# EasyEDA Pro project V2_compatibility_export_as_received.epro, schematic SCH_ESP32P4_Prototype_V2.3b6

## Sheets
1 USB_UART/Other IO: Board Name: cm4; Create Date: 2026-07-14; Page Name: 继电器板子; Project Name: New Project_2025-01-23_00-40-50; Schematic Name: Schematic3_7; Update Date: 2026-07-14; Company: 嘉立创EDA; Page Size: A4; Version: V1.0
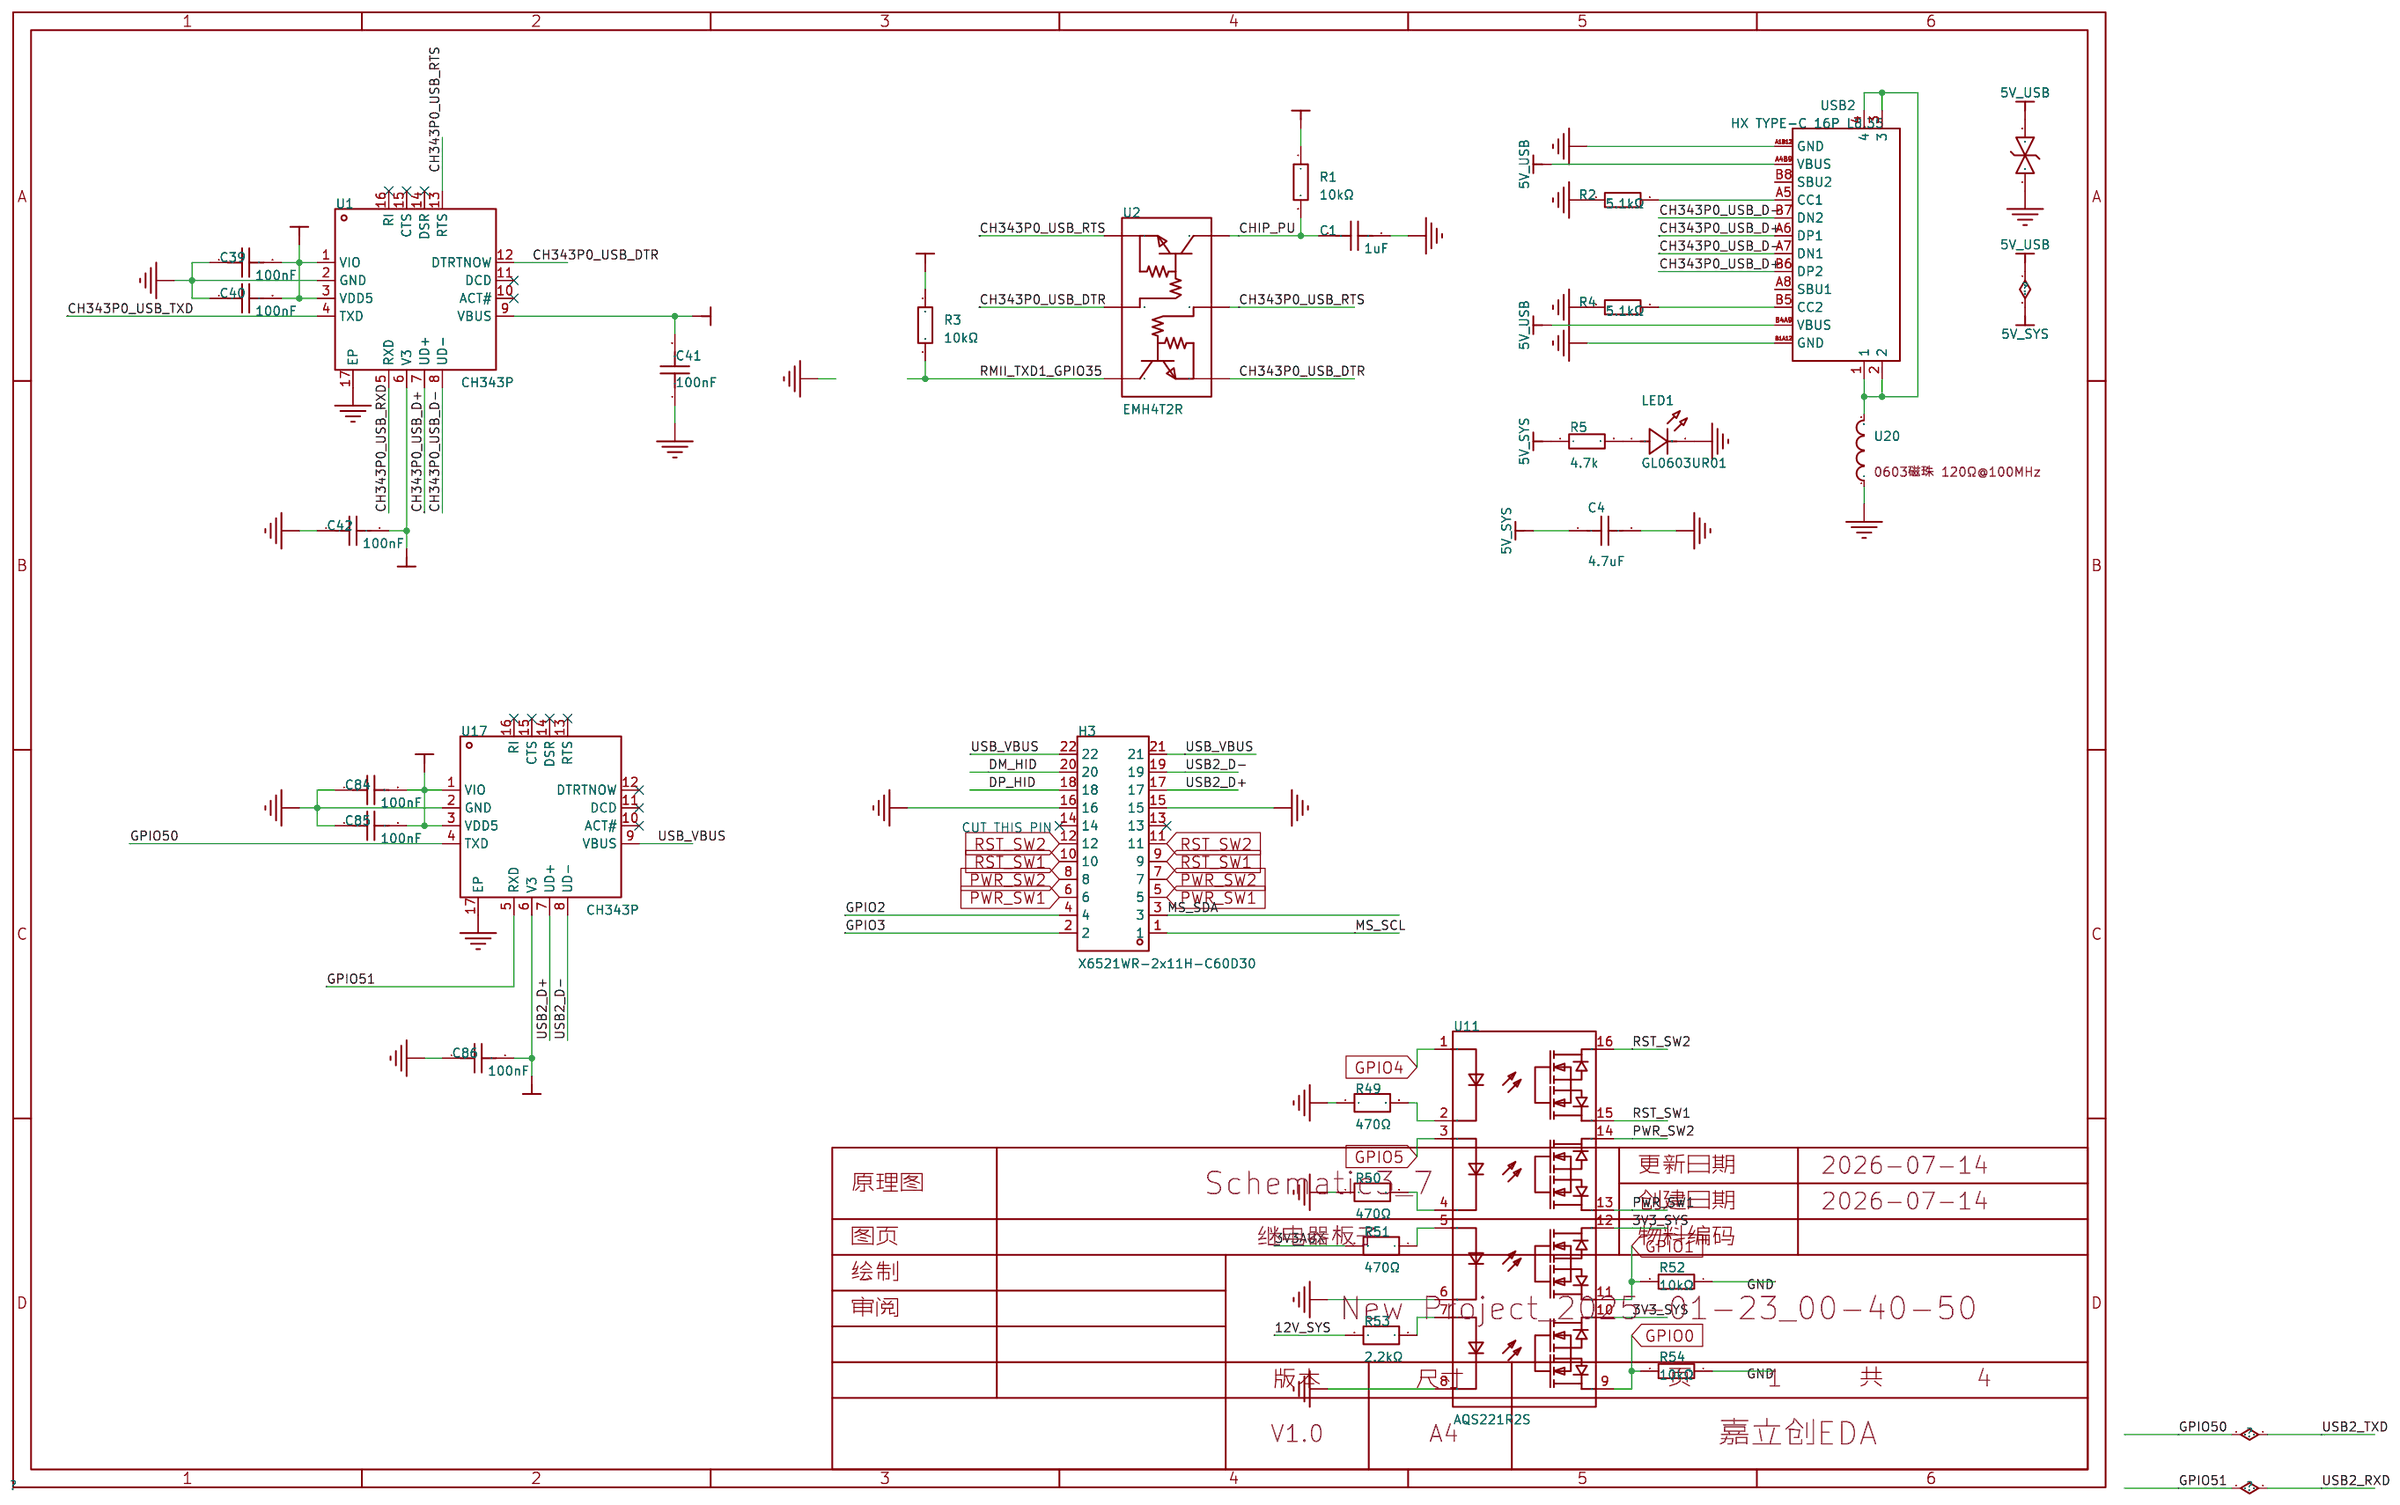
[diagram p0: USB_UART/Other IO]
2 ETH: Create Date: 2026-07-13; Page Name: IO; Update Date: 2026-07-13
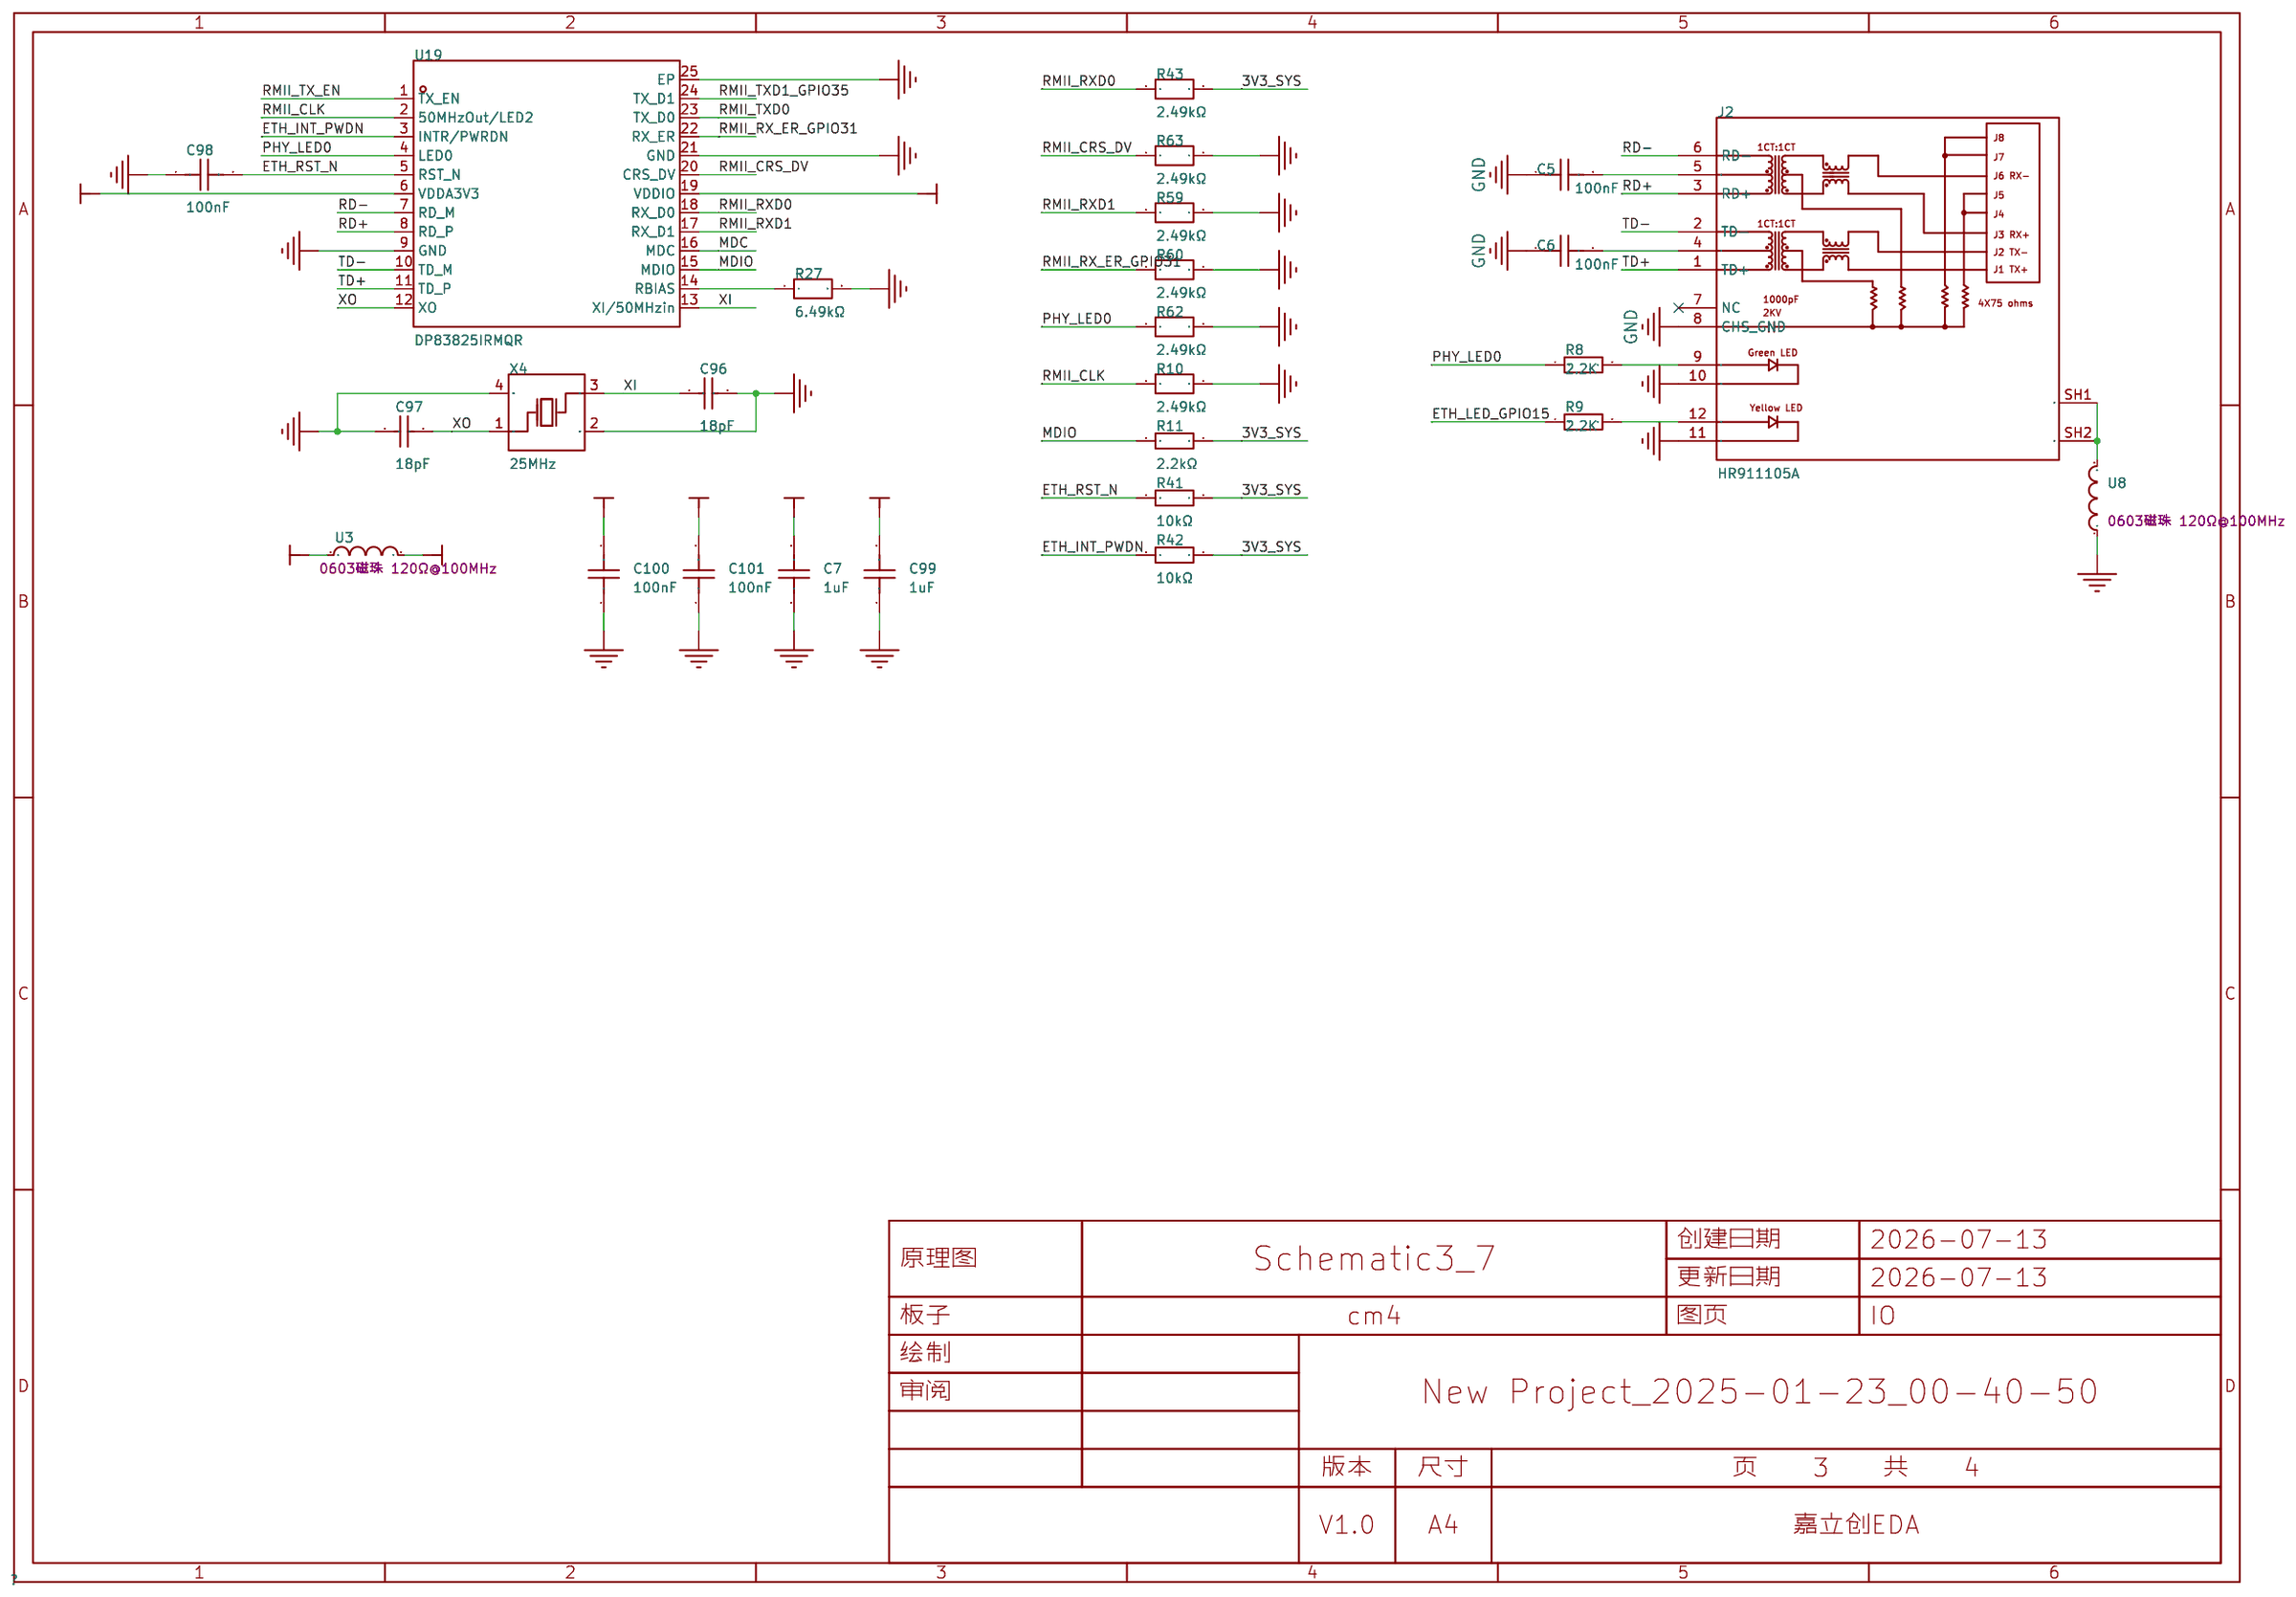
[diagram p1: ETH]
3 HDMI_Captrue_MS2109: Create Date: 2026-07-15; Page Name: 采集卡; Update Date: 2026-07-15
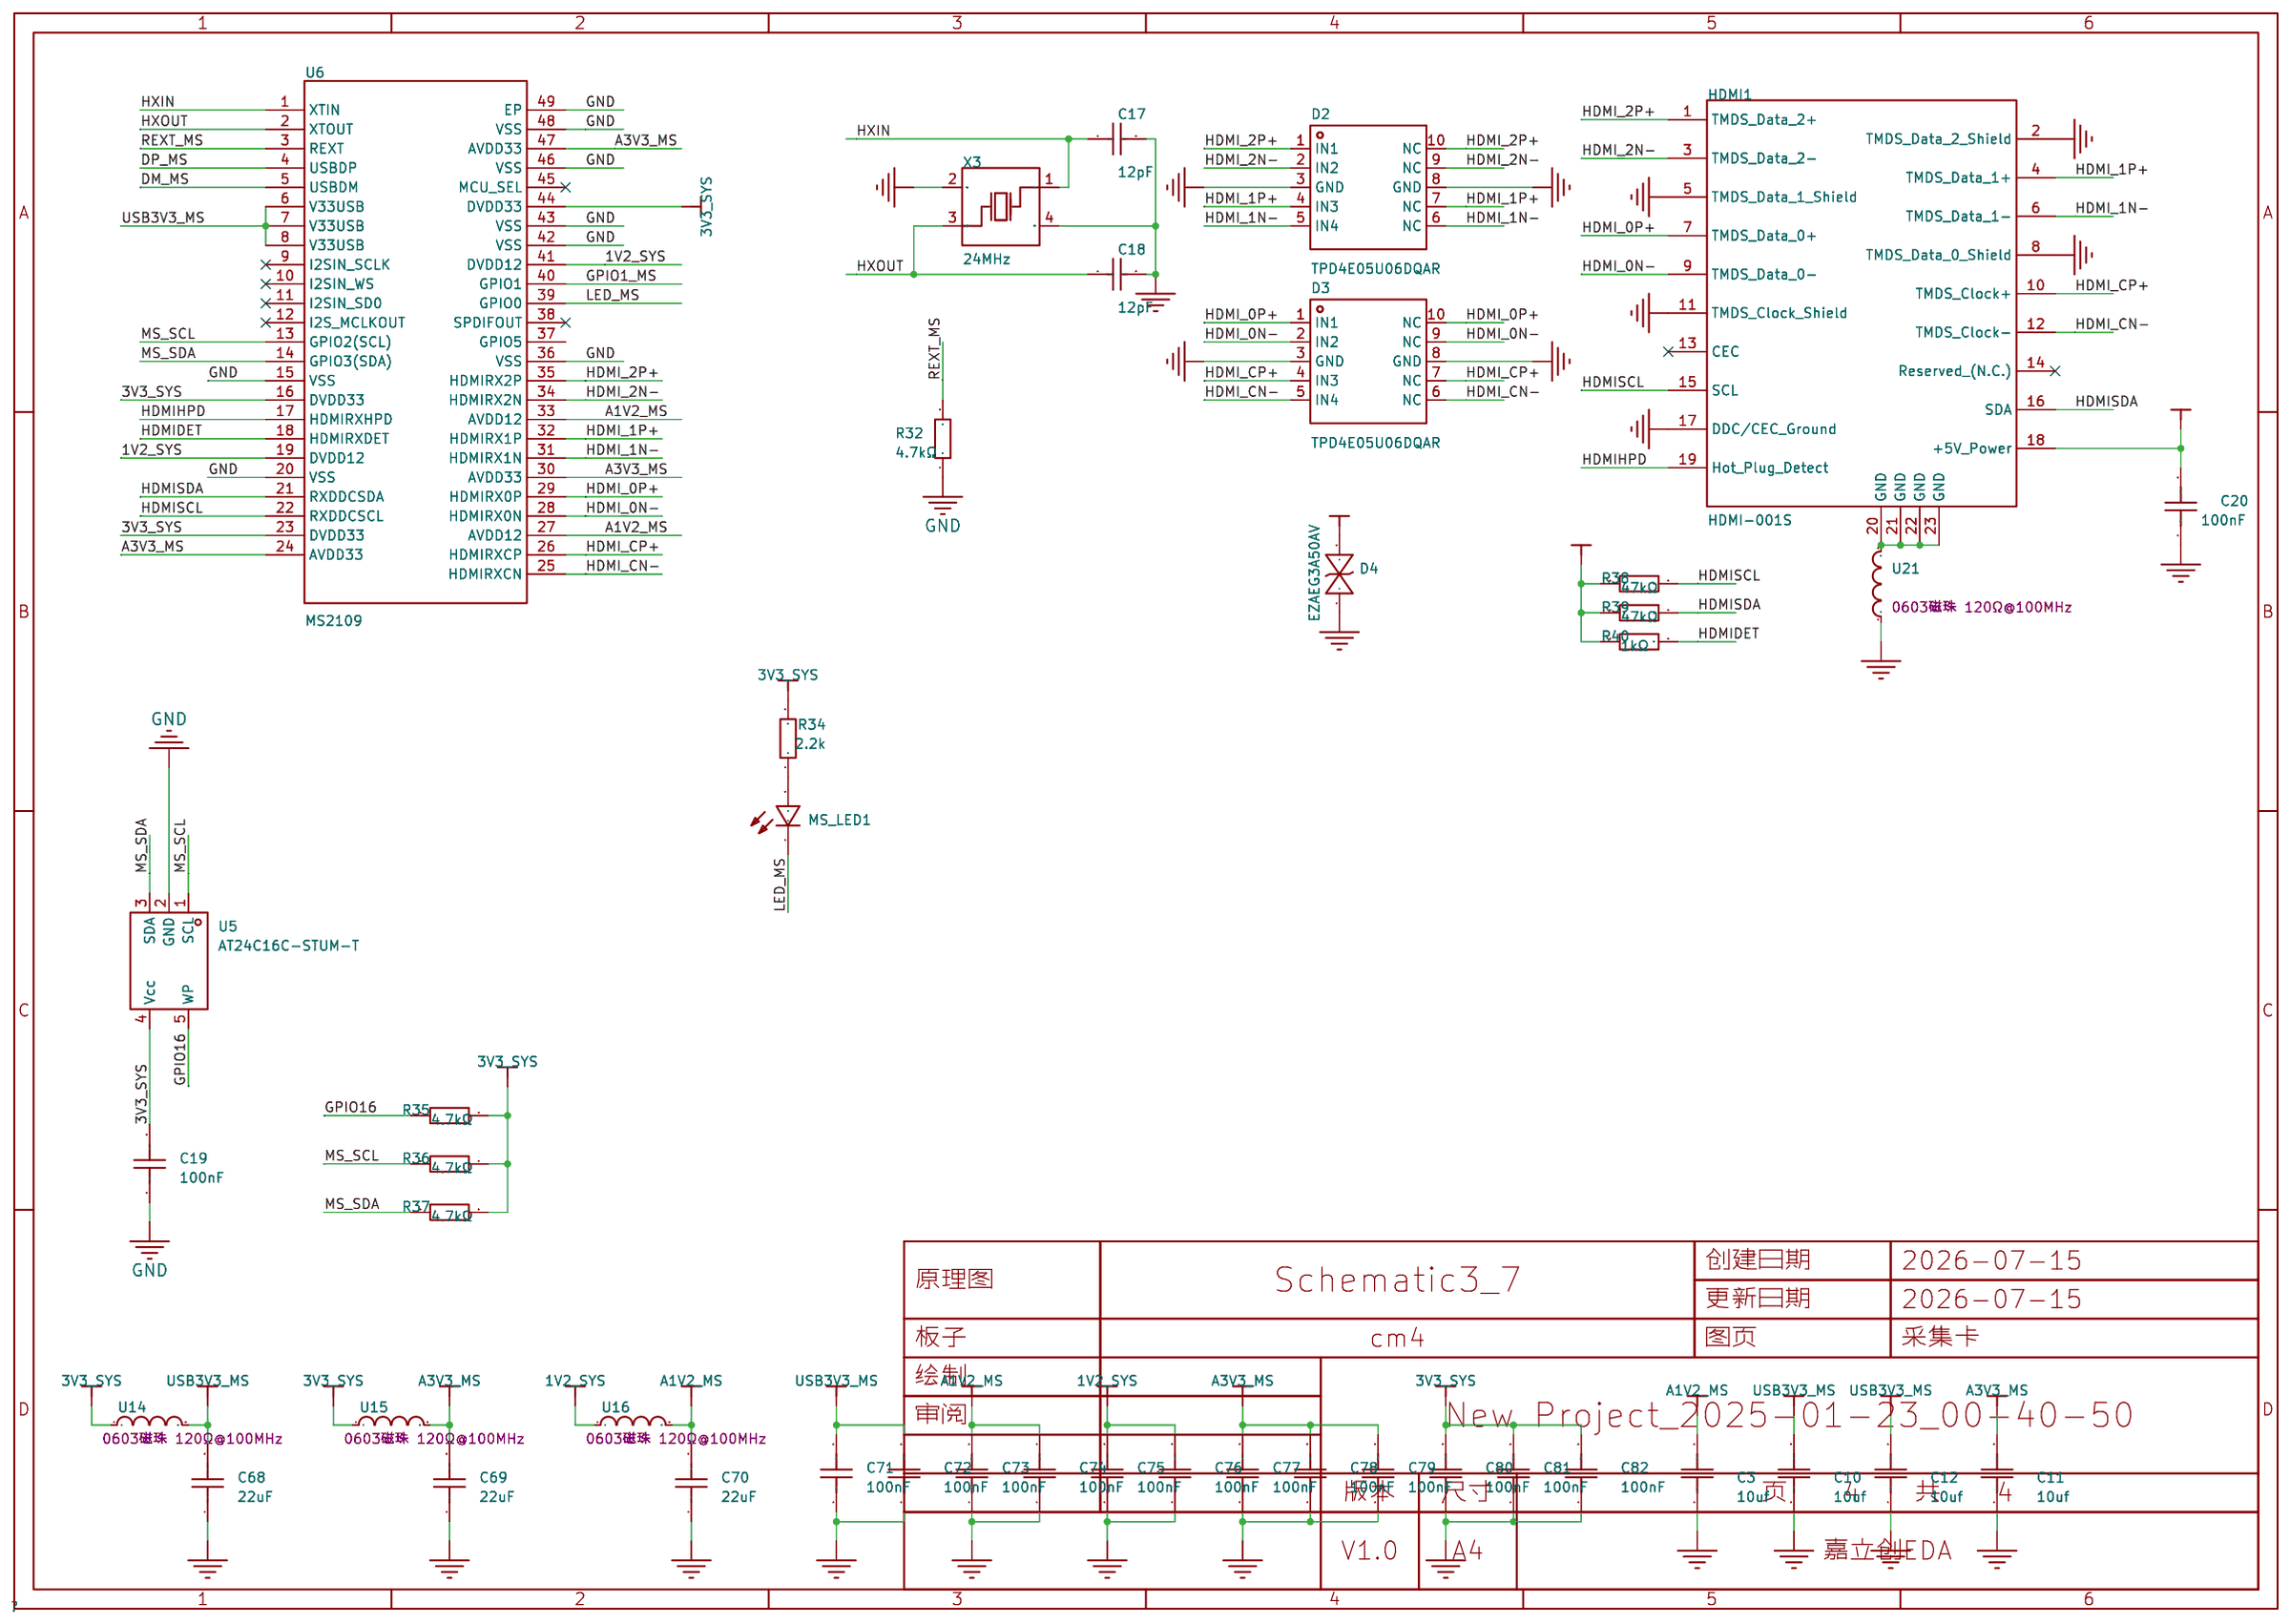
[diagram p2: HDMI_Captrue_MS2109]
4 Power: Assembly Variant: Basic; Create Date: 2026-07-19; Page Name: P1; Project Name: 远程开机卡; Update Date: 2026-07-19
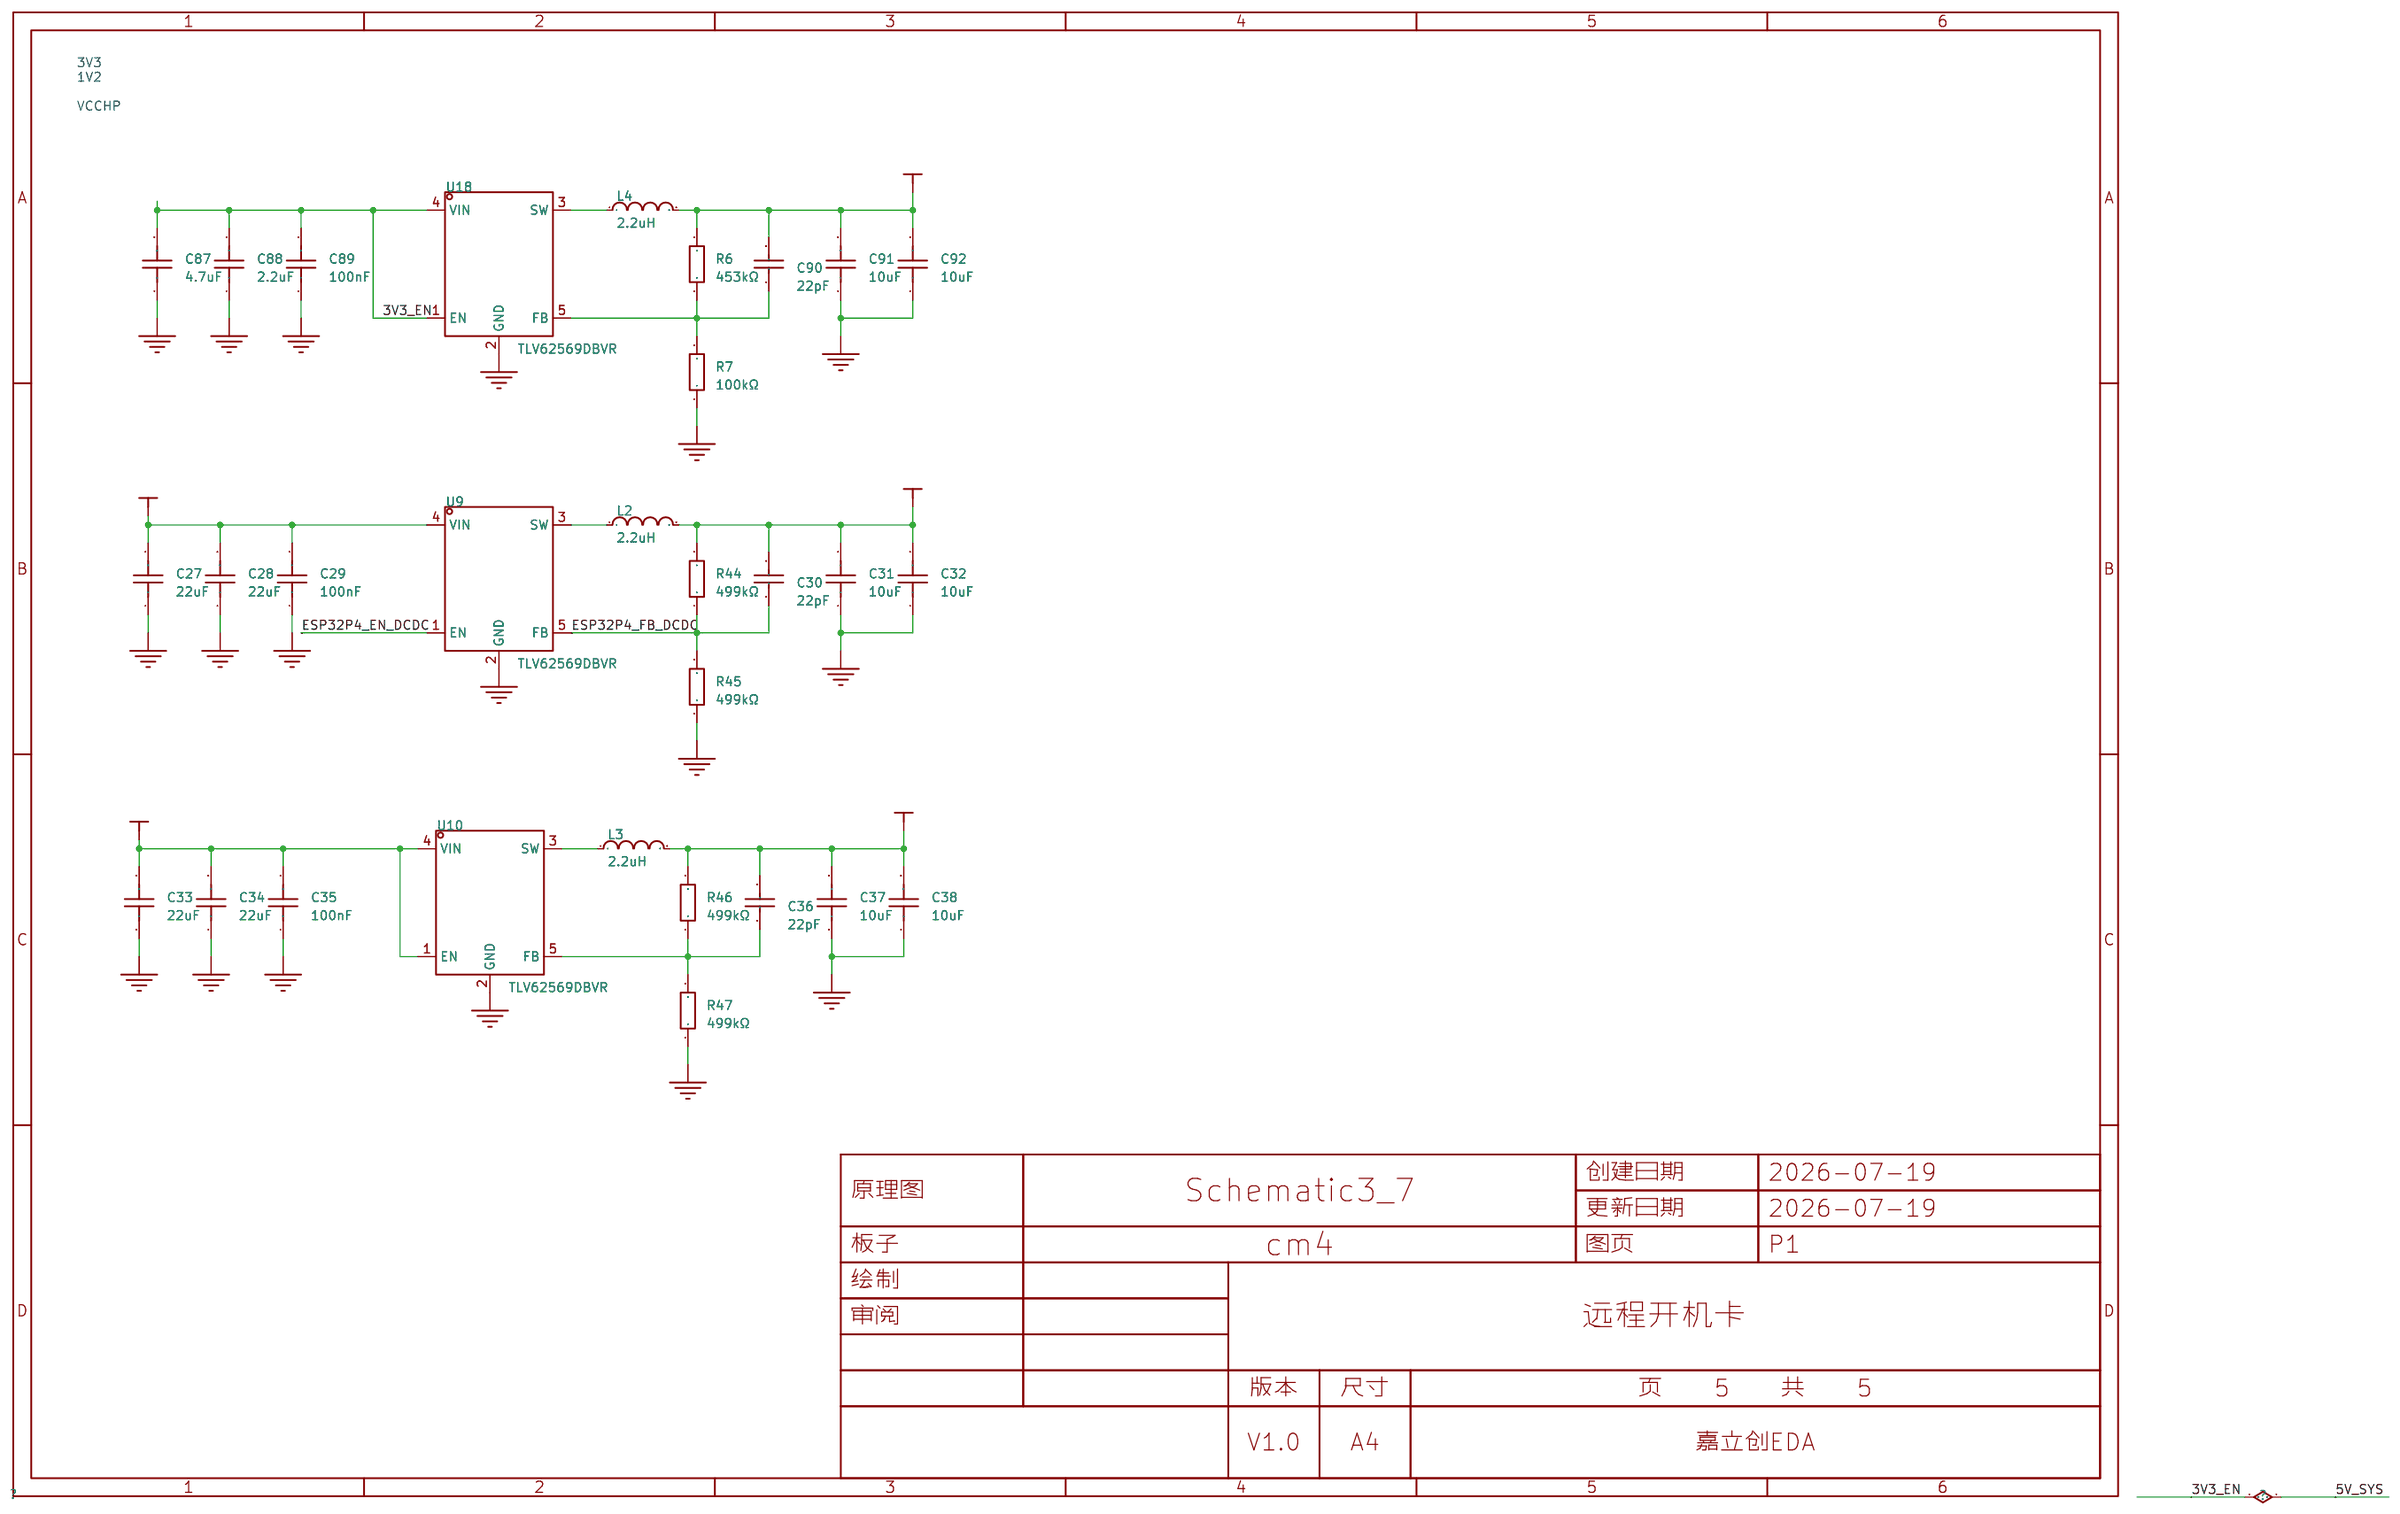
[diagram p3: Power]
5 P1: Assembly Variant: Basic; Create Date: 2026-07-11; Page Name: P1; Project Name: 远程开机卡; Update Date: 2026-07-11
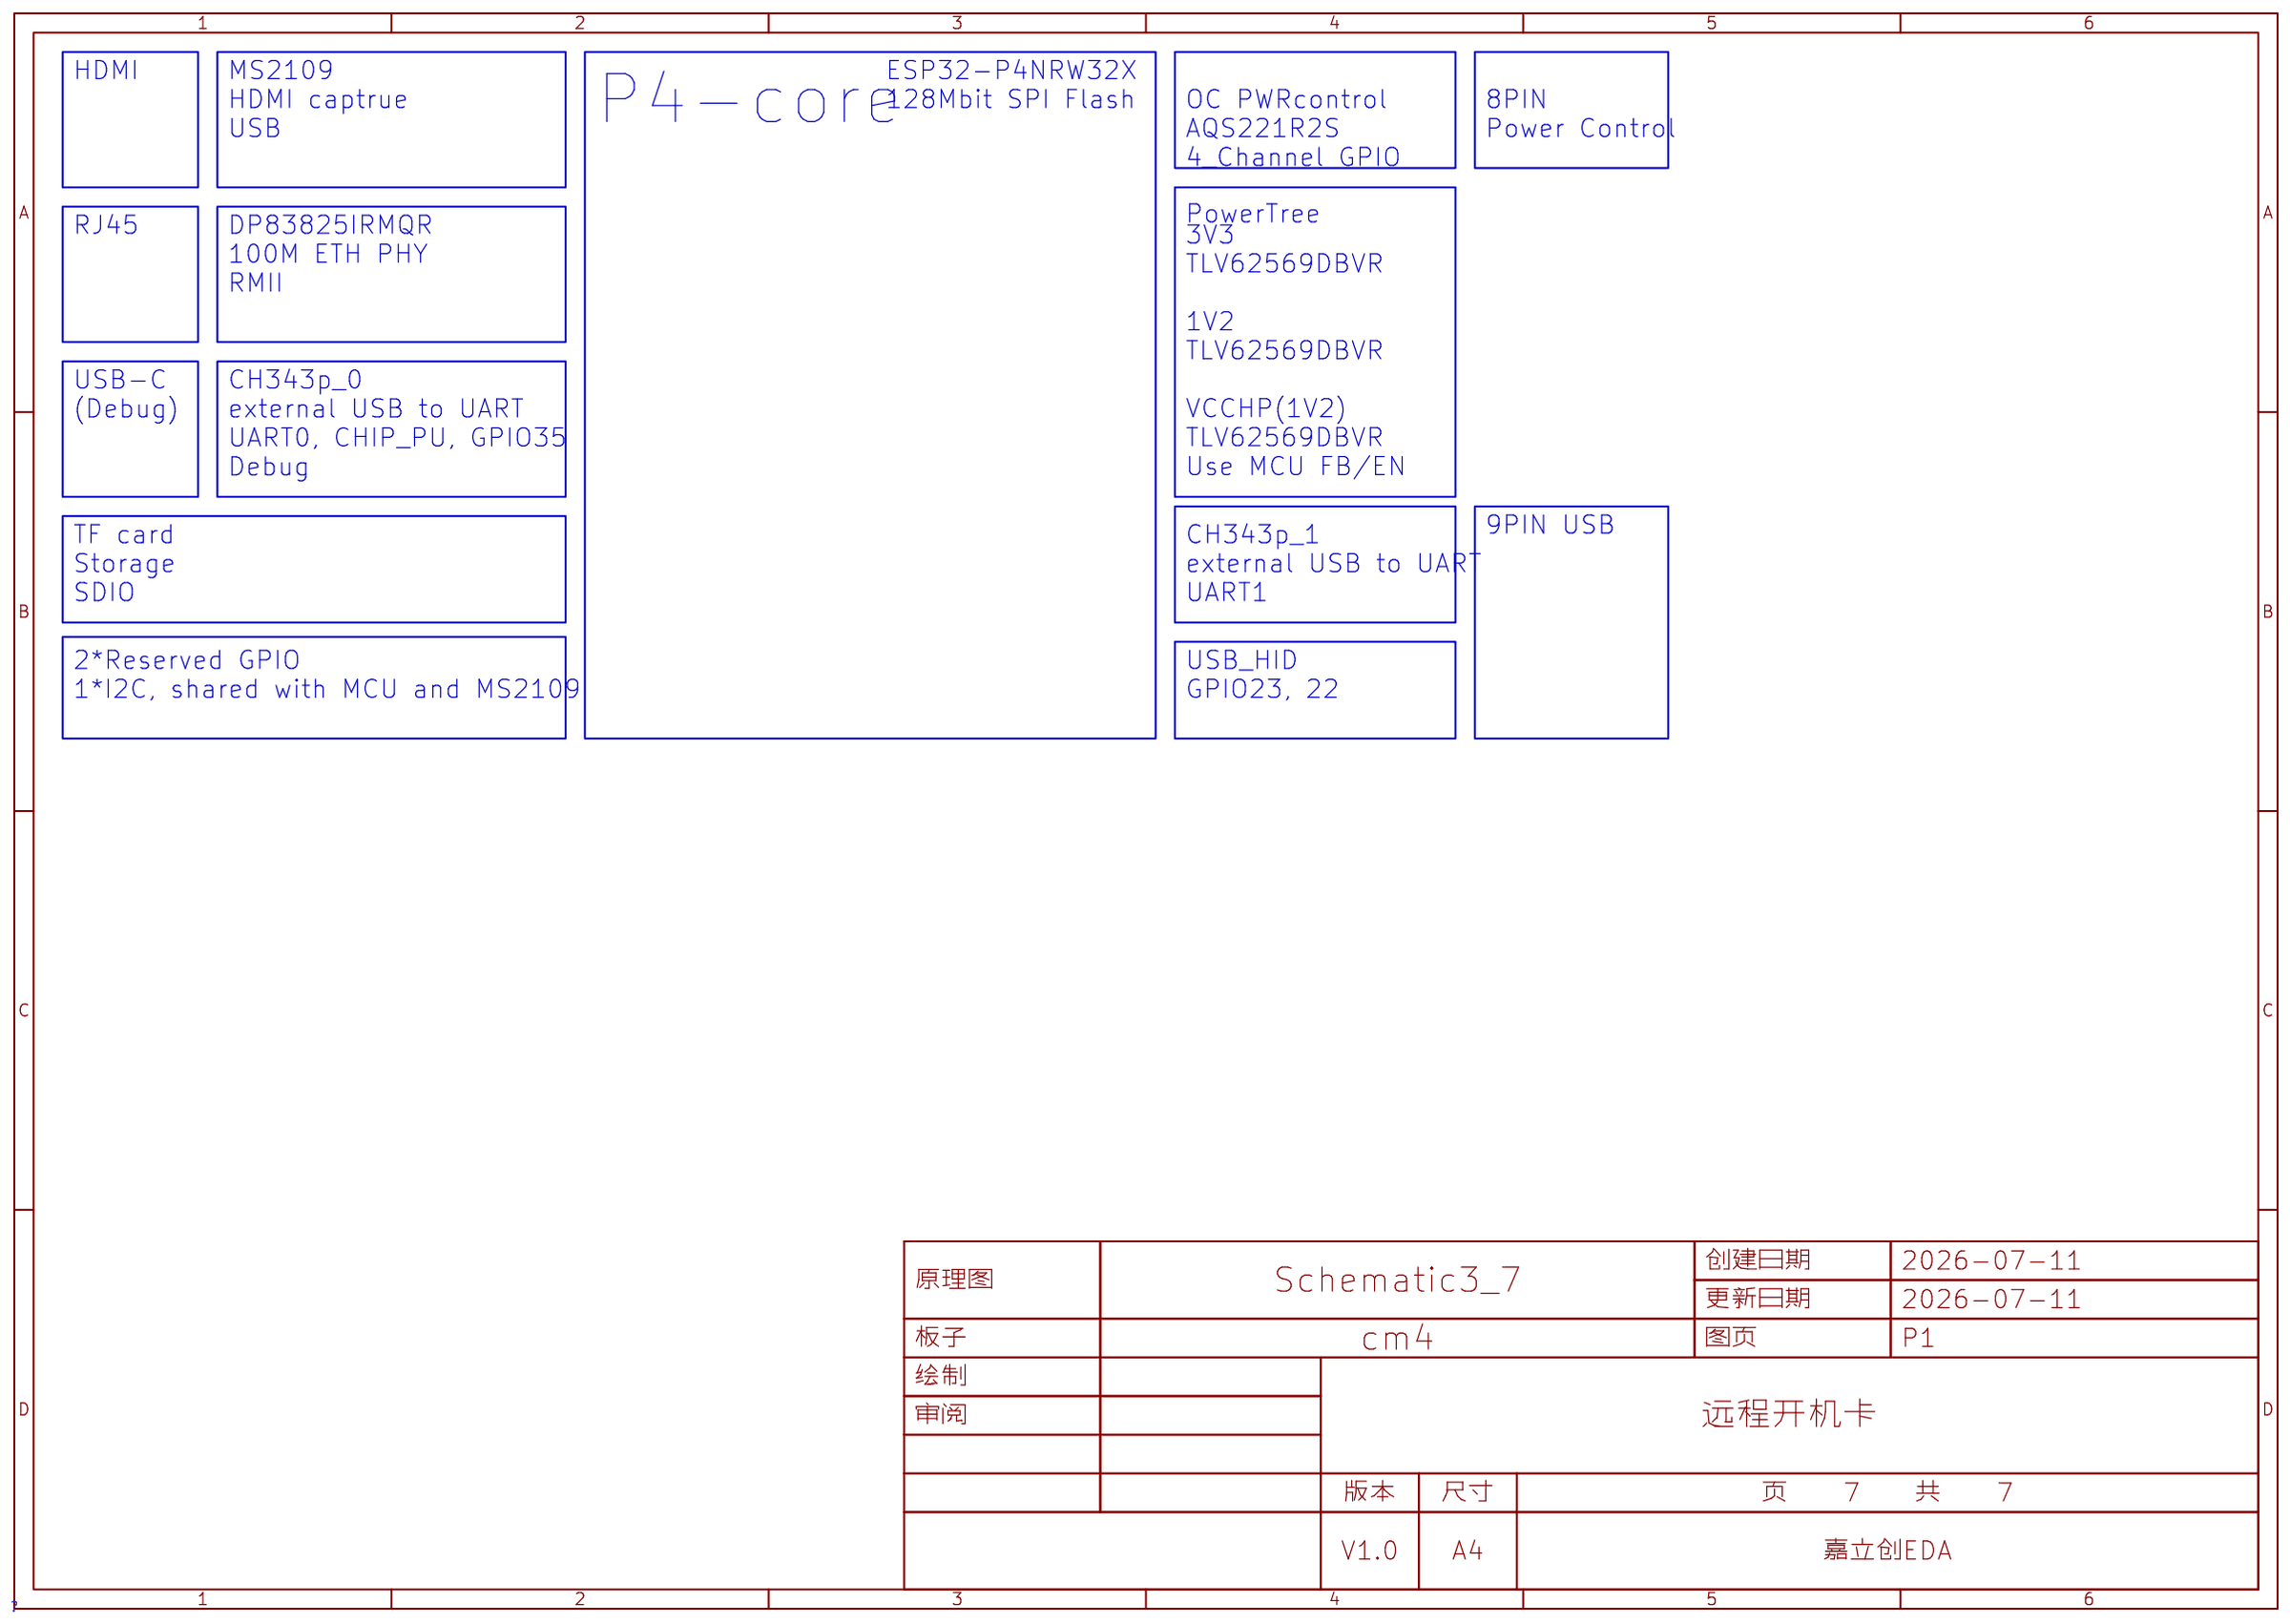
[diagram p4: P1]
6 P4: Assembly Variant: Basic; Board Name: cm4_1; Create Date: 2026-07-15; Page Name: P3; Project Name: 远程开机卡; Schematic Name: SCH_1; Update Date: 2026-07-15
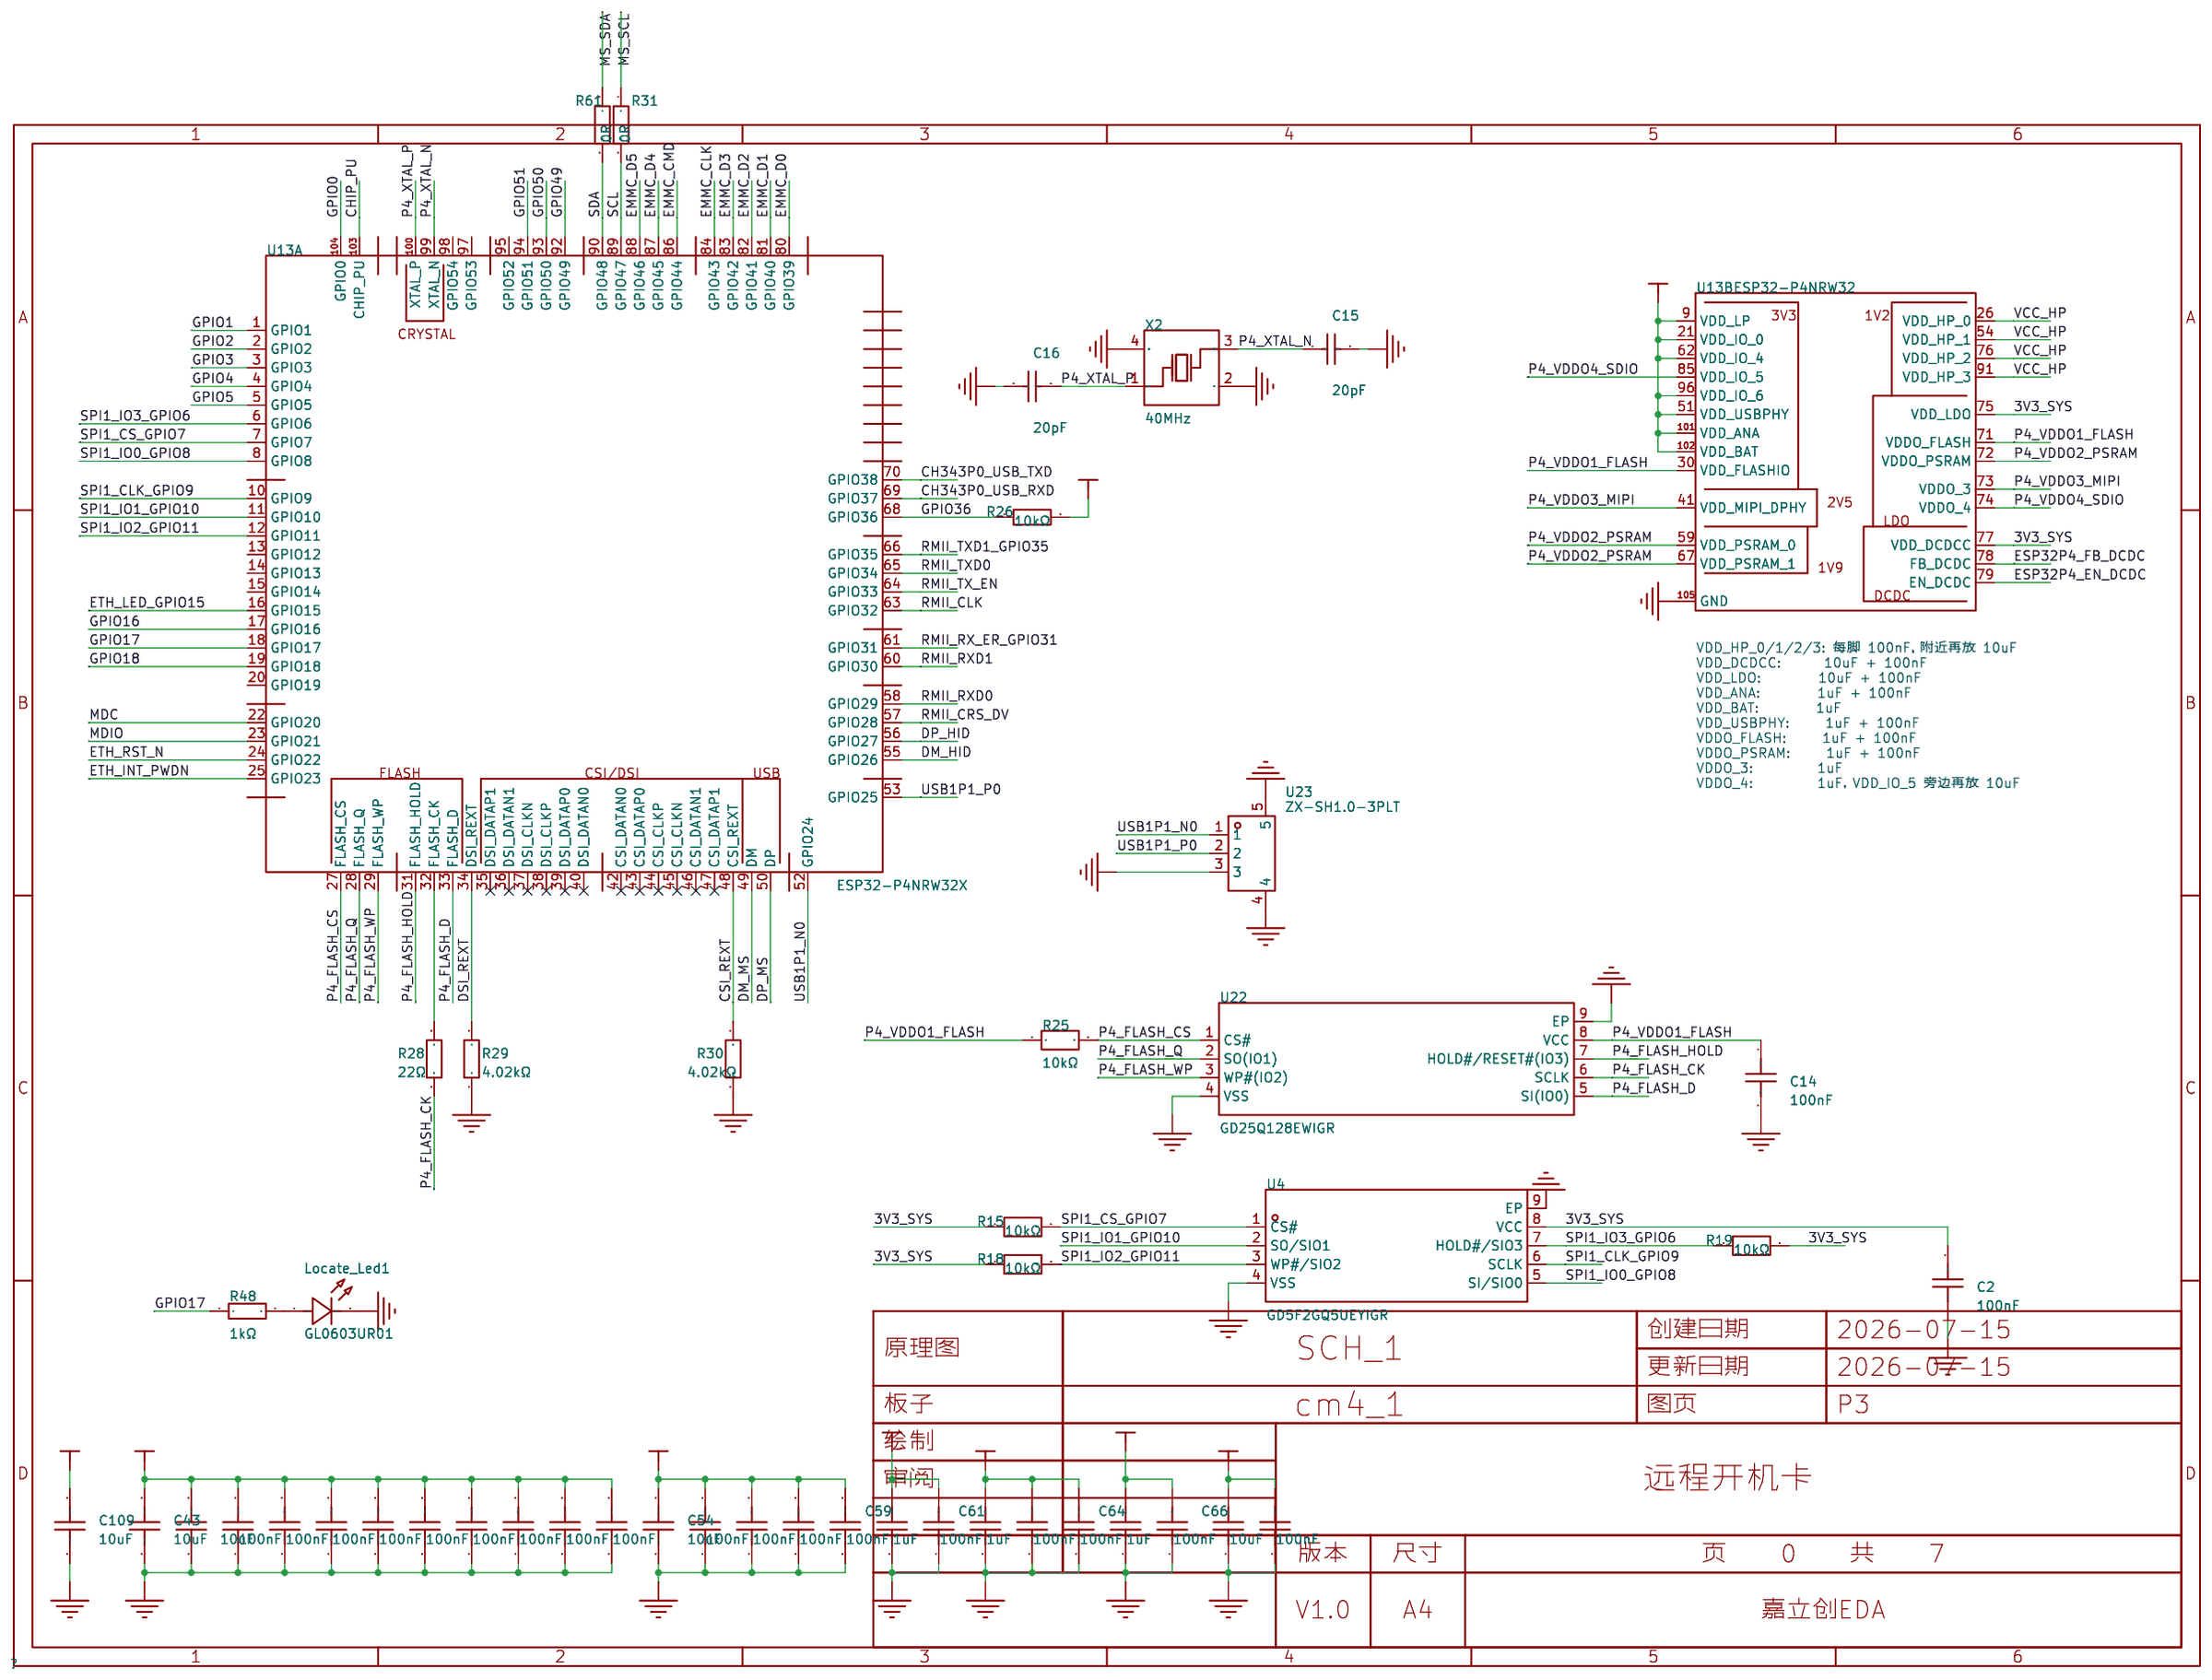
[diagram p5: P4]
7 PCIe: Assembly Variant: Basic; Board Name: ESP32P4_PCIE_FULL; Create Date: 2026-07-11; Page Name: P5; Project Name: 远程开机卡; Schematic Name: SCH_3; Update Date: 2026-07-11
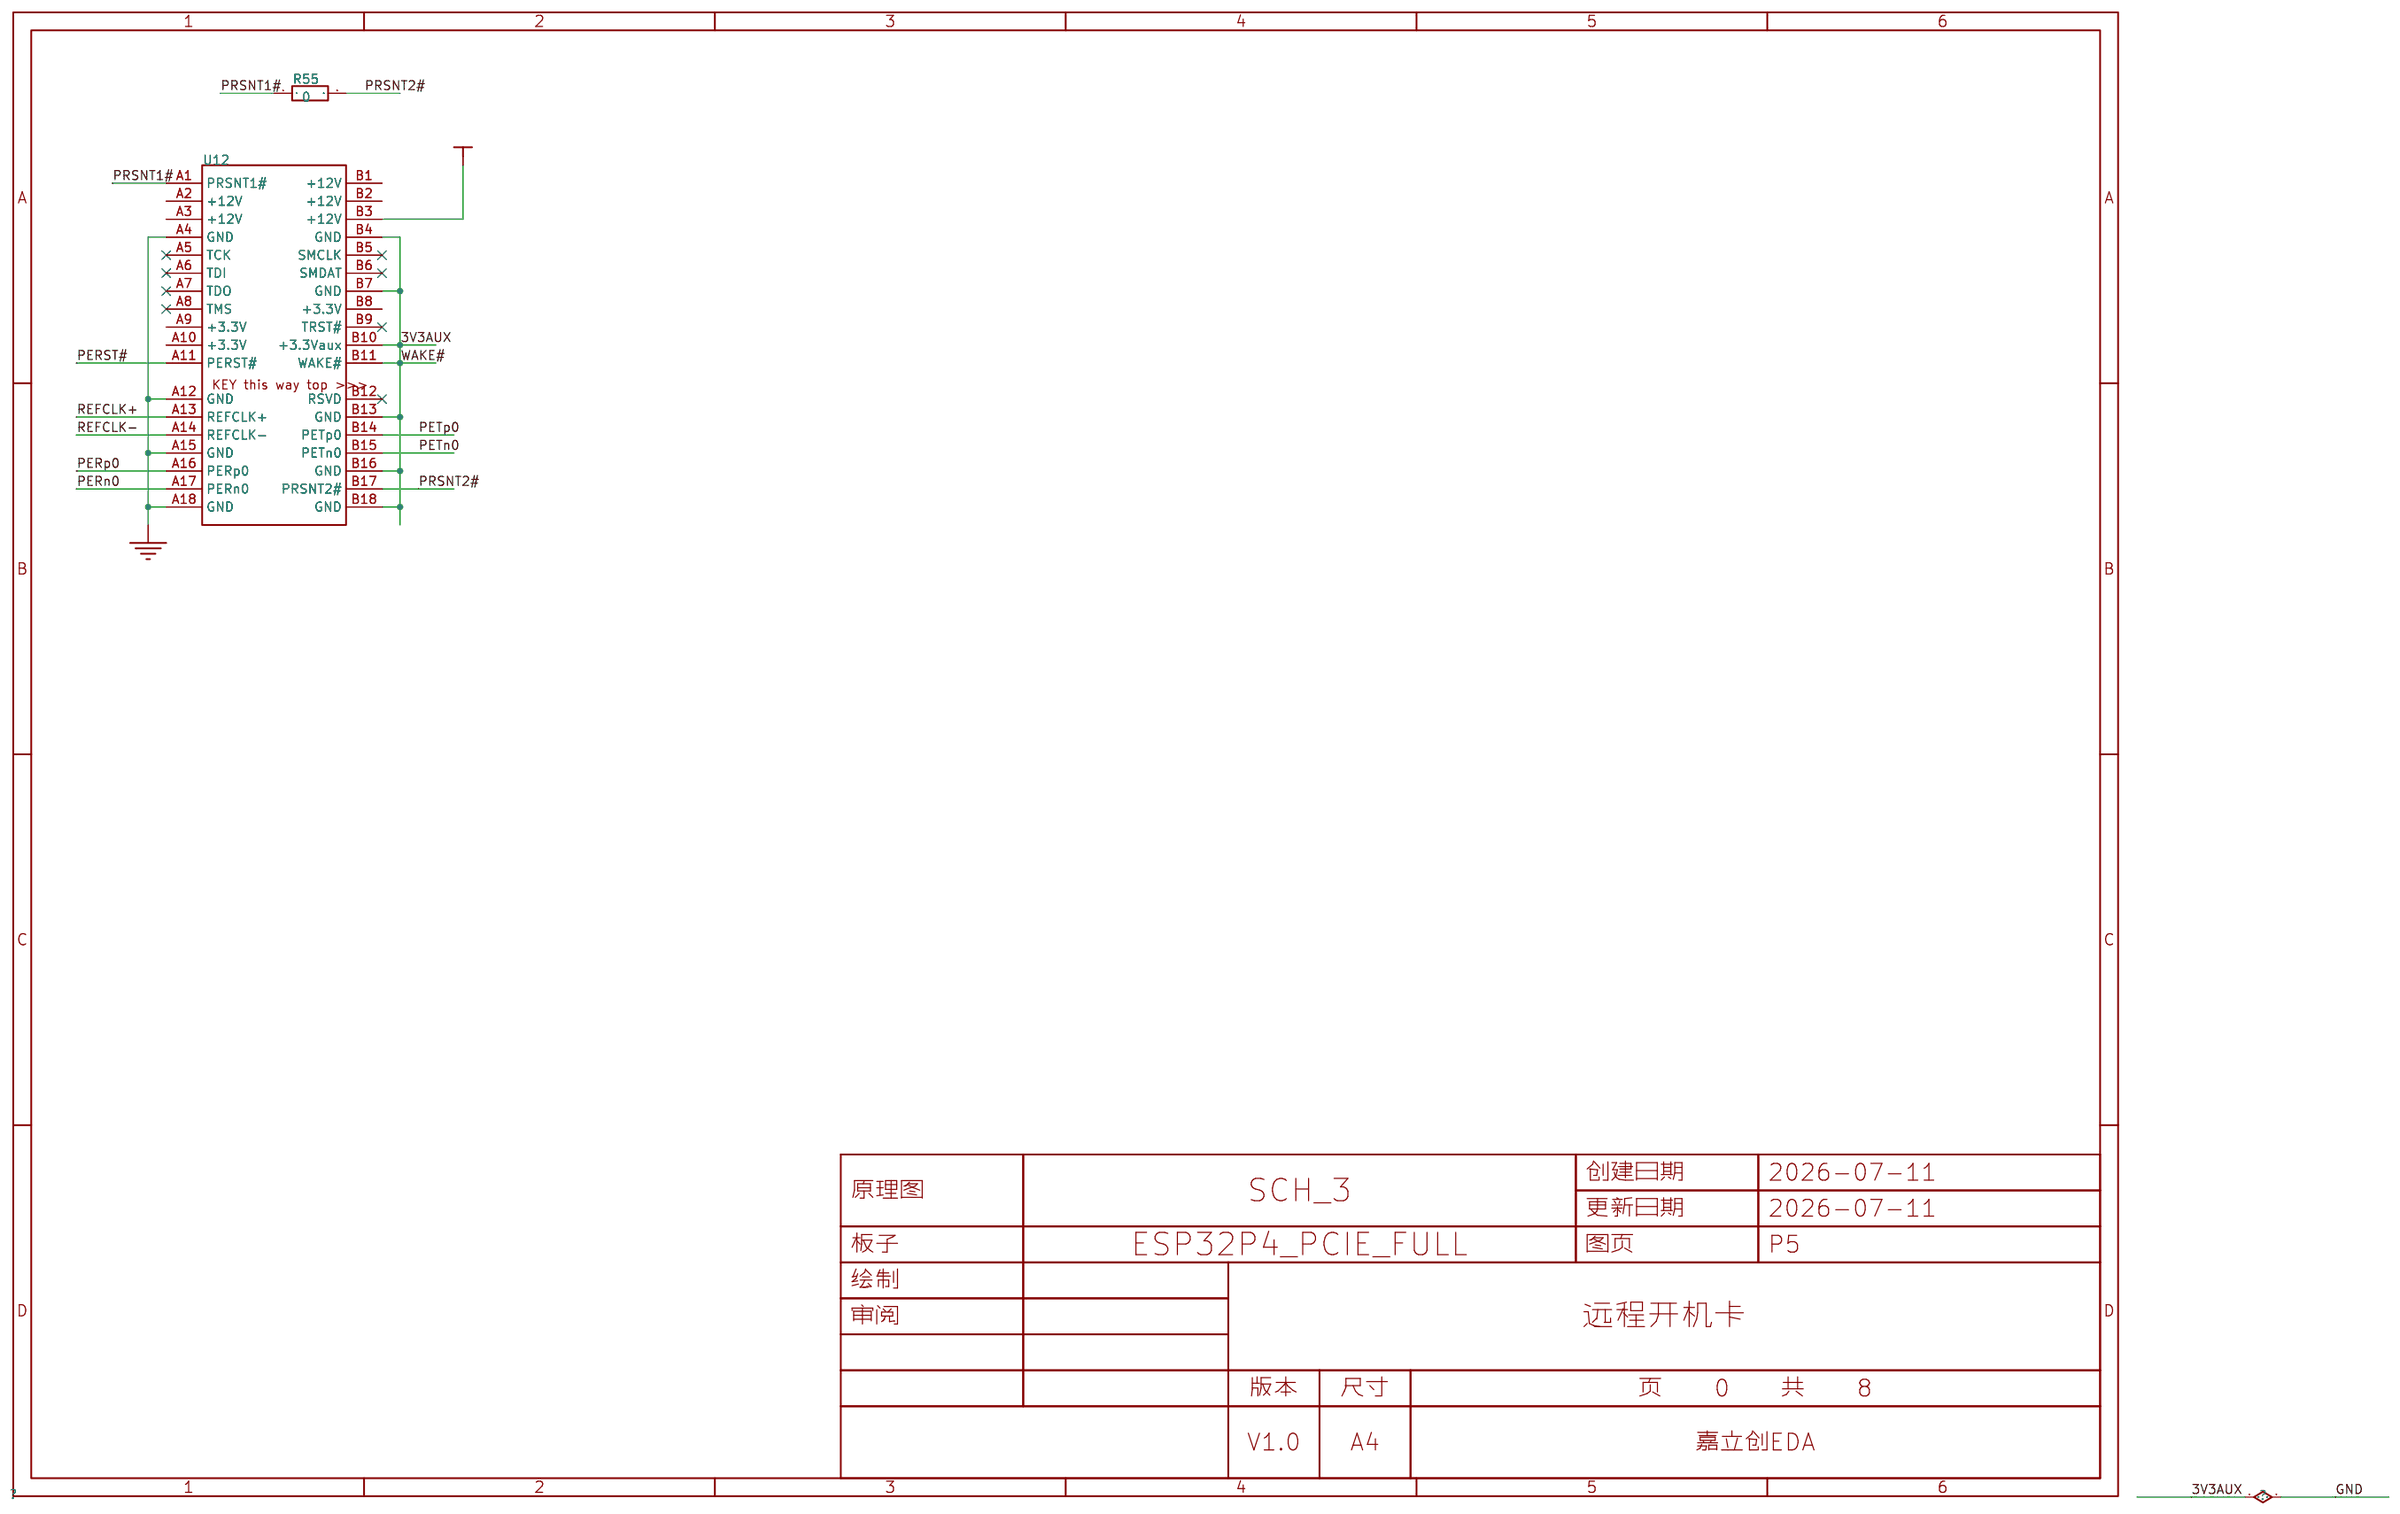
[diagram p6: PCIe]
8 TF: Assembly Variant: Basic; Board Name: ESP32P4_Prototype_V2.1; Create Date: 2026-07-12; Page Name: P5; Project Name: ExoAnchor-ESP32P4; Schematic Name: SCH_6; Update Date: 2026-07-12
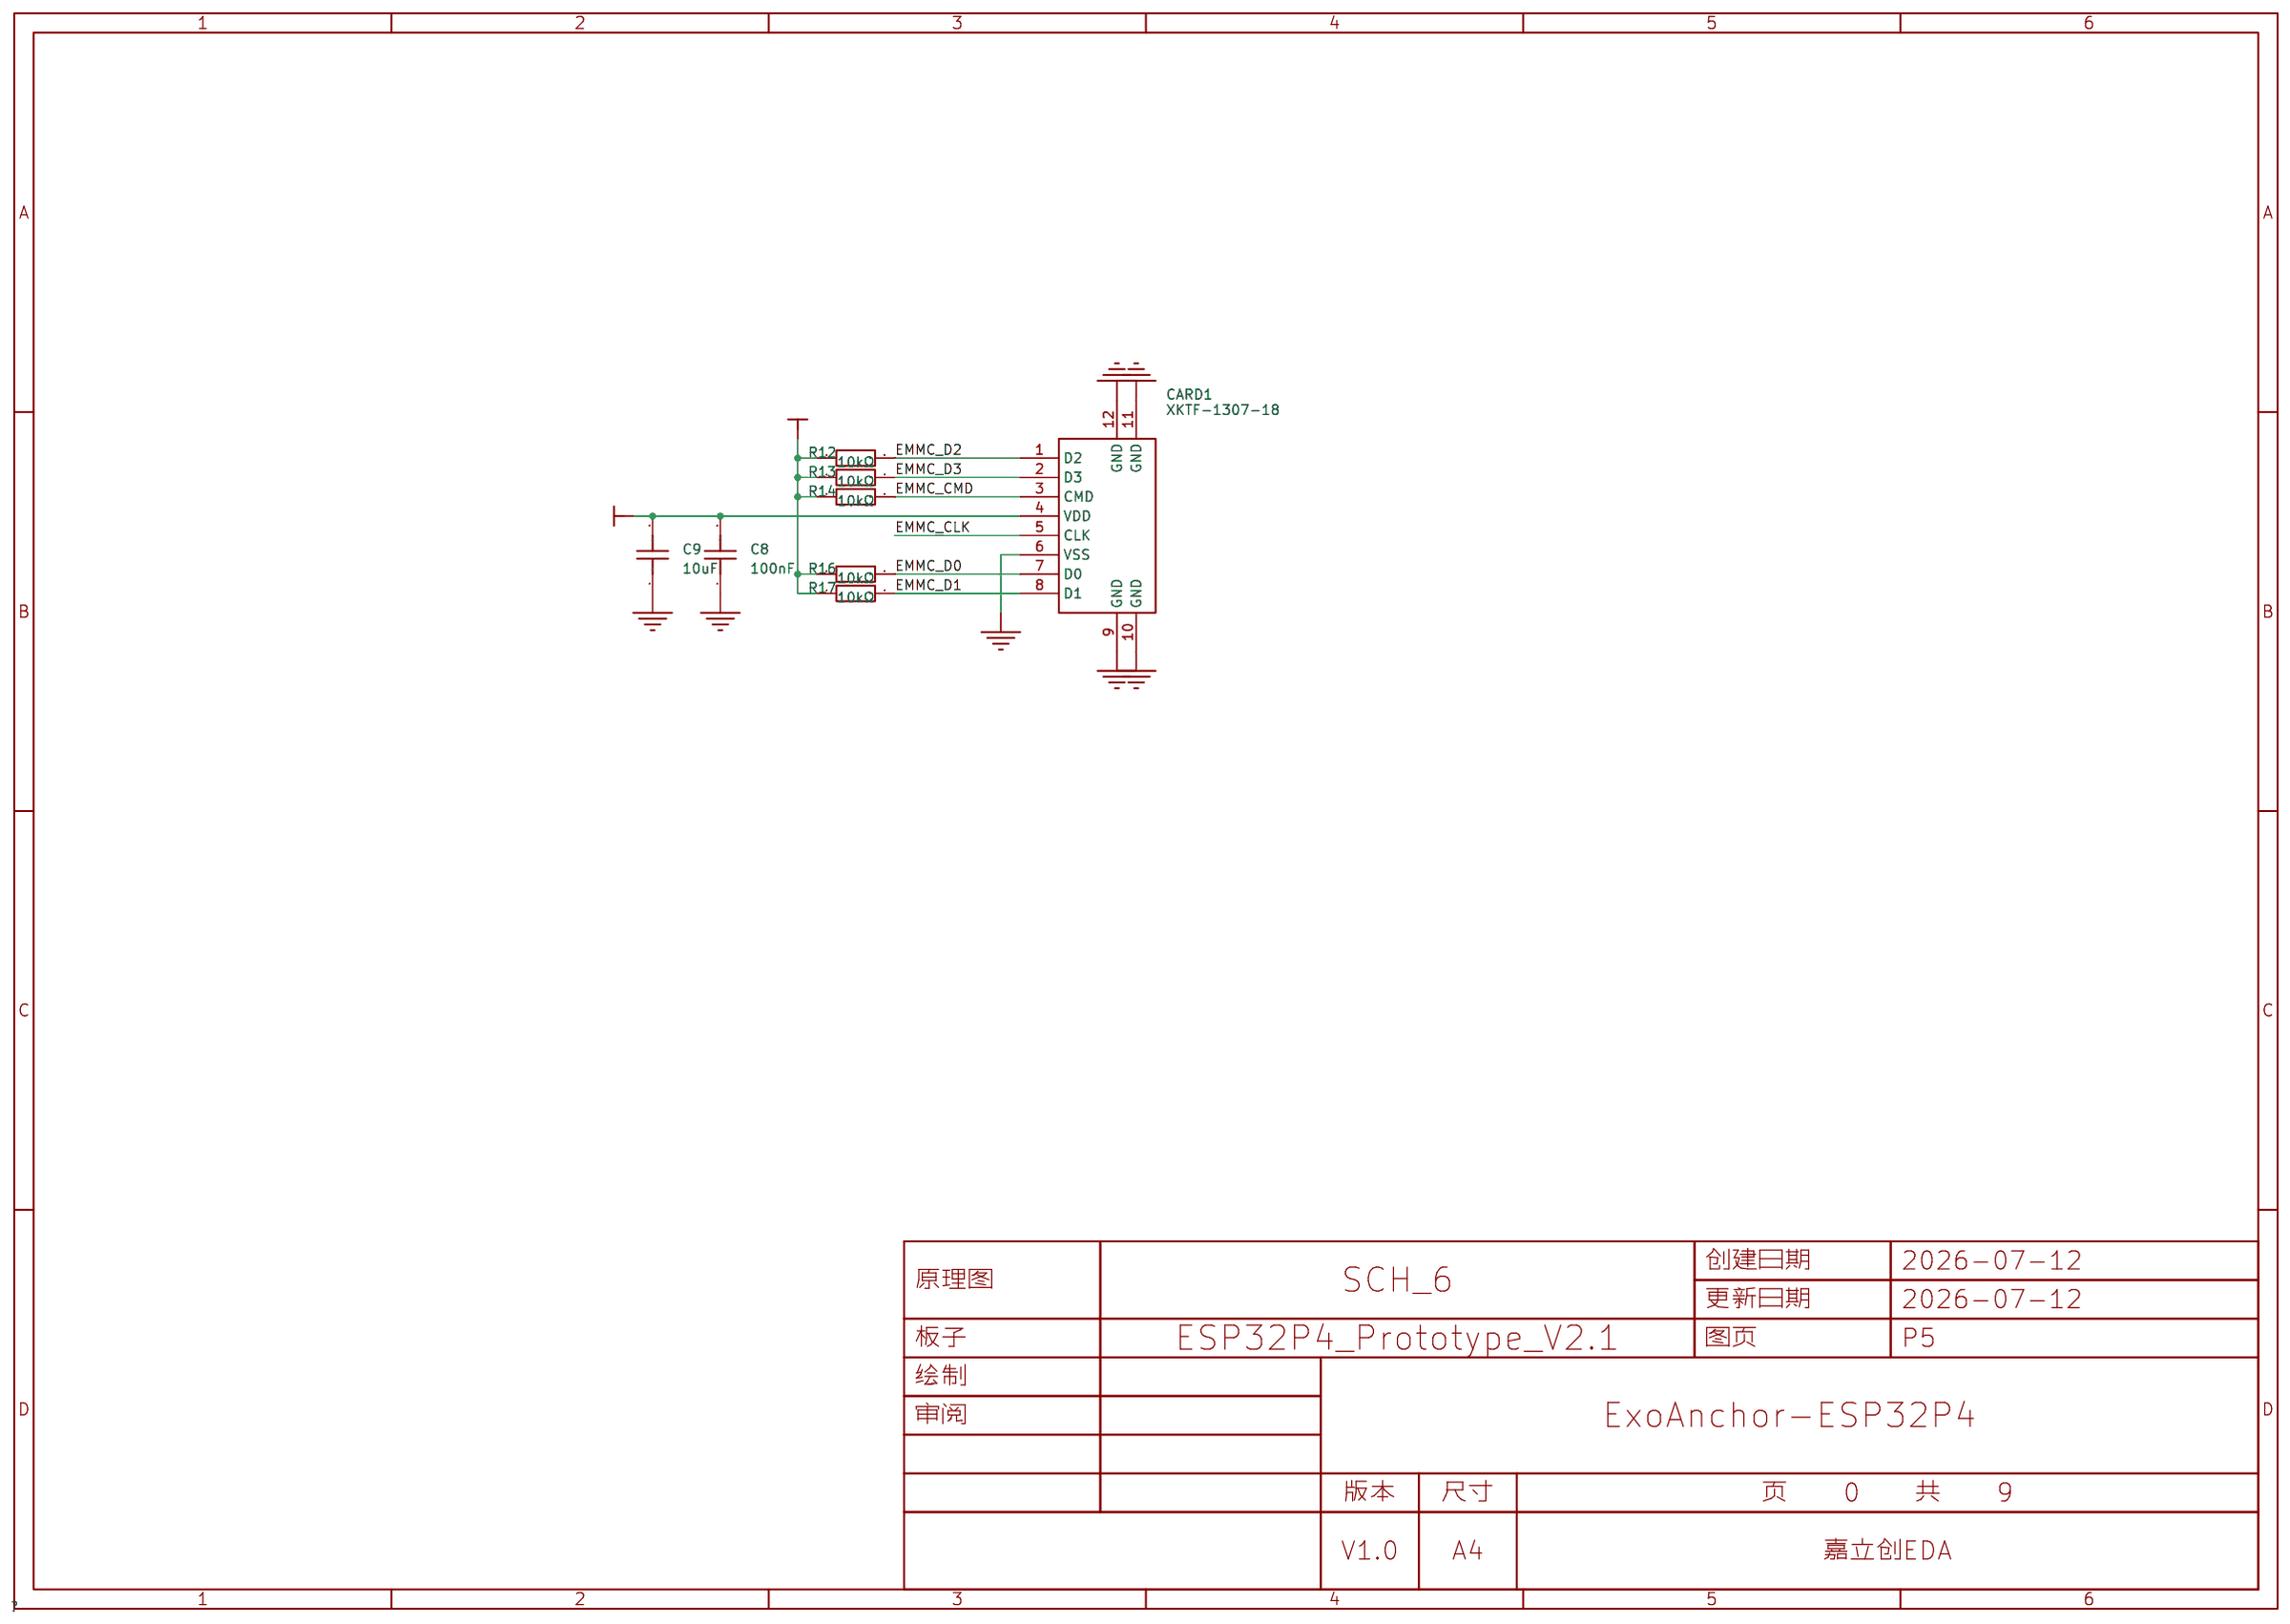
[diagram p7: TF]

## Parts
sheet ETH
C5  100nF  [C0402 去耦电容]
C6  100nF  [C0402 去耦电容]
C7  1uF  [C0603]
C96  18pF  [C0402]
C97  18pF  [C0402]
C98  100nF  [C0402 去耦电容]
C99  1uF  [C0603]
C100  100nF  [C0402 去耦电容]
C101  100nF  [C0402 去耦电容]
J2  HR911105A  [RJ45-TH_HR911105A]
R8  2.2K  [R0402]
R9  2.2K  [R0402]
R10  2.49kΩ  [R0402]
R11  2.2kΩ  [R0402]
R27  6.49kΩ  [R0402]
R41  10kΩ  [R0402]
R42  10kΩ  [R0402]
R43  2.49kΩ  [R0402]
R59  2.49kΩ  [R0402]
R60  2.49kΩ  [R0402]
R62  2.49kΩ  [R0402]
R63  2.49kΩ  [R0402]
U3  BLM18PG121SN1D  [L0603]
U8  BLM18PG121SN1D  [L0603]
U19  DP83825IRMQR  [HVQFN-24_L3.0-W3.0-P0.40-TL-EP1.9]
X4  25MHz  [CRYSTAL-SMD_4P-L3.2-W2.5-BL]
sheet HDMI_Captrue_MS2109
C3  10uf  [C0603]
C10  10uf  [C0603]
C11  10uf  [C0603]
C12  10uf  [C0603]
C17  12pF  [C0402]
C18  12pF  [C0402]
C19  100nF  [C0603]
C20  100nF  [C0603]
C68  22uF  [C0805]
C69  22uF  [C0805]
C70  22uF  [C0805]
C71  100nF  [C0402 去耦电容]
C72  100nF  [C0402 去耦电容]
C73  100nF  [C0402 去耦电容]
C74  100nF  [C0402 去耦电容]
C75  100nF  [C0402 去耦电容]
C76  100nF  [C0402 去耦电容]
C77  100nF  [C0402 去耦电容]
C78  100nF  [C0402 去耦电容]
C79  100nF  [C0402 去耦电容]
C80  100nF  [C0402 去耦电容]
C81  100nF  [C0402 去耦电容]
C82  100nF  [C0402 去耦电容]
D2  TPD4E05U06DQAR  [USON-10_L2.5-W1.0-P0.50-BL]
D3  TPD4E05U06DQAR  [USON-10_L2.5-W1.0-P0.50-BL]
D4  EZAEG3A50AV  [D0603-BI]
HDMI1  HDMI-001S  [HDMI-SMD_HDMI-001S]
MS_LED1  NCD0603R1  [LED0603-RD_RED]
R32  4.7kΩ  [R0402]
R34  2.2k  [R0603]
R35  4.7kΩ  [R0603]
R36  4.7kΩ  [R0603]
R37  4.7kΩ  [R0603]
R38  47kΩ  [R0603]
R39  47kΩ  [R0603]
R40  1kΩ  [R0603]
U5  AT24C16C-STUM-T  [SOT-23-5_L2.9-W1.6-P0.95-LS2.8-BL]
U6  MS2109  [QFN-48_L7.0-W7.0-P0.50-TL-EP4.1]
U14  BLM18PG121SN1D  [L0603]
U15  BLM18PG121SN1D  [L0603]
U16  BLM18PG121SN1D  [L0603]
U21  BLM18PG121SN1D  [L0603]
X3  24MHz  [CRYSTAL-SMD_4P-L3.2-W2.5-BL]
sheet P4
C2  100nF  [C0402]
C14  100nF  [C0402]
C15  20pF  [C0603]
C16  20pF  [C0603]
C43  10uF  [C0805]
C44  10uF  [C0805]
C45  100nF  [C0402 去耦电容]
C46  100nF  [C0402 去耦电容]
C47  100nF  [C0402 去耦电容]
C48  100nF  [C0402 去耦电容]
C49  100nF  [C0402 去耦电容]
C50  100nF  [C0402 去耦电容]
C51  100nF  [C0402 去耦电容]
C52  100nF  [C0402 去耦电容]
C53  100nF  [C0402 去耦电容]
C54  10uF  [C0603]
C55  100nF  [C0402 去耦电容]
C56  100nF  [C0402 去耦电容]
C57  100nF  [C0402 去耦电容]
C58  100nF  [C0402 去耦电容]
C59  1uF  [C0402]
C60  100nF  [C0402 去耦电容]
C61  1uF  [C0402]
C62  100nF  [C0402 去耦电容]
C63  100nF  [C0402 去耦电容]
C64  1uF  [C0402]
C65  100nF  [C0402 去耦电容]
C66  10uF  [C0402]
C67  100nF  [C0402 去耦电容]
C109  10uF  [C0805]
Locate_Led1  GL0603UR01  [LED0603-FD]
R15  10kΩ  [R0402]
R18  10kΩ  [R0402]
R19  10kΩ  [R0402]
R25  10kΩ  [R0402]
R26  10kΩ  [R0603]
R28  22Ω  [R0402]
R29  4.02kΩ  [R0402]
R30  4.02kΩ  [R0402]
R31  0R  [R0402]
R48  1kΩ  [R0603]
R61  0R  [R0402]
U4  GD5F2GQ5UEYIGR  [WSON-8_L6.0-W8.0-P1.27-BL-EP]
U13  ESP32-P4NRW32X  [QFN-104_L10.0-W10.0-P0.35-TL-EP7.5]  (sections 1,2(PWR/GND))
U22  GD25Q128EWIGR  [WSON-8_L6.0-W5.0-P1.27-TL-EP]
U23  ZX-SH1.0-3PLT  [CONN-SMD_3P-P1.00_HDGC_HDGC1002WV-S-3P]
X2  40MHz  [OSC-SMD_4P-L3.2-W2.5-BL_SIT8008BI]
sheet PCIe
R55  0  [R0603]
U12  -  [PCIe*1 key]
sheet Power
C27  22uF  [C0805]
C28  22uF  [C0805]
C29  100nF  [C0603]
C30  22pF  [C0603]
C31  10uF  [C0805]
C32  10uF  [C0805]
C33  22uF  [C0805]
C34  22uF  [C0805]
C35  100nF  [C0603]
C36  22pF  [C0603]
C37  10uF  [C0805]
C38  10uF  [C0805]
C87  4.7uF  [C0805]
C88  2.2uF  [C0805]
C89  100nF  [C0603]
C90  22pF  [C0603]
C91  10uF  [C0805]
C92  10uF  [C0805]
L2  2.2uH  [IND-SMD_L3.0-W3.0_FNR30XXS]
L3  2.2uH  [IND-SMD_L3.0-W3.0_FNR30XXS]
L4  2.2uH  [IND-SMD_L3.0-W3.0_FNR30XXS]
R6  453kΩ  [R0603]
R7  100kΩ  [R0603]
R44  499kΩ  [R0603]
R45  499kΩ  [R0603]
R46  499kΩ  [R0603]
R47  499kΩ  [R0603]
U9  TLV62569DBVR  [SOT-23-5_L3.0-W1.7-P0.95-LS2.8-BR]
U10  TLV62569DBVR  [SOT-23-5_L3.0-W1.7-P0.95-LS2.8-BR]
U18  TLV62569DBVR  [SOT-23-5_L3.0-W1.7-P0.95-LS2.8-BR]
sheet TF
C8  100nF  [C0603]
C9  10uF  [C0603]
CARD1  XKTF-1307-18  [TF-SMD_XKTF-1307-18]
R12  10kΩ  [R0603]
R13  10kΩ  [R0603]
R14  10kΩ  [R0603]
R16  10kΩ  [R0603]
R17  10kΩ  [R0603]
sheet USB_UART/Other IO
C1  1uF  [C0402]
C4  4.7uF  [C0805]
C39  100nF  [C0402 去耦电容]
C40  100nF  [C0402 去耦电容]
C41  100nF  [C0402 去耦电容]
C42  100nF  [C0402 去耦电容]
C84  100nF  [C0402 去耦电容]
C85  100nF  [C0402 去耦电容]
C86  100nF  [C0402 去耦电容]
D1  SLPESD0603M05  [D0603-BI]
H3  X6521WR-2x11H-C60D30  [HDR-TH_22P-P2.54-H-M-R2-C11-S2.54]
LED1  GL0603UR01  [LED0603-FD]
R1  10kΩ  [R0402]
R2  5.1kΩ  [R0402]
R3  10kΩ  [R0402]
R4  5.1kΩ  [R0402]
R5  4.7k  [R0402]
R49  470Ω  [R0603]
R50  470Ω  [R0603]
R51  470Ω  [R0603]
R52  10kΩ  [R0603]
R53  2.2kΩ  [R0603]
R54  10kΩ  [R0603]
U1  CH343P  [TQFN-16_L3.0-W3.0-P0.50-BL-EP1.7]
U2  EMH4T2R  [SOT-563-6_L1.6-W1.2-P0.50-LS1.6-BL]
U11  AQS221R2S  [SO-16_L10.3-W4.4-P1.27-LS7.0-BL]
U17  CH343P  [TQFN-16_L3.0-W3.0-P0.50-BL-EP1.7]
U20  BLM18PG121SN1D  [L0603]
USB2  HX TYPE-C 16P L8.35  [USB-C-SMD_HX-TYPE-C-16P-L8.35]

## Library data of the parts
C5 C6 = CC0603KRX7R9BB104: 容值:100nF;精度:±10%;额定电压:50V;材质(温度系数):X7R;; LCSC Part Name: 100nF ±10% 50V; Supplier Part: C14663; Manufacturer: YAGEO(国巨); Supplier Footprint: 0603; JLCPCB Part Class: Basic Part; Datasheet: https://atta.szlcsc.com/upload/public/pdf/source/20180910/C282072_33301C7F631E79921B82A8DAC6BCC5B3.pdf; Supplier: LCSC; Tolerance: ±10%; Voltage Rated: 50V; Temperature Coefficient: X7R
C1 C7 C59 C61 C64 C99 = CL05A105KA5NQNC: 容值:1uF;精度:±10%;额定电压:25V;温度系数:X5R;; LCSC Part Name: 1uF ±10% 25V; Supplier Part: C52923; Manufacturer: SAMSUNG(三星); Supplier Footprint: 0402; JLCPCB Part Class: Basic Part; Datasheet: https://item.szlcsc.com/datasheet/CL05A105KA5NQNC/53938.html; Supplier: LCSC; Tolerance: ±10%; Voltage Rating: 25V; Temperature Coefficient: X5R
C96 C97 = CL10C180JB8NNNC: 容值:18pF;精度:±5%;额定电压:50V;温度系数:C0G;; LCSC Part Name: 18pF ±5% 50V; Supplier Part: C1647; Manufacturer: SAMSUNG(三星); Supplier Footprint: 0603; JLCPCB Part Class: Basic Part; Datasheet: https://item.szlcsc.com/datasheet/CL10C180JB8NNNC/1999.html; Supplier: LCSC; Tolerance: ±5%; Voltage Rating: 50V; Temperature Coefficient: C0G
C98 C100 C101 = CC0603KRX7R9BB104: 容值:100nF;精度:±10%;额定电压:50V;温度系数:X7R;; LCSC Part Name: 100nF ±10% 50V; Supplier Part: C14663; Manufacturer: YAGEO(国巨); Supplier Footprint: 0603; JLCPCB Part Class: Basic Part; Datasheet: https://item.szlcsc.com/datasheet/CC0603KRX7R9BB104/15331.html; Supplier: LCSC; Tolerance: ±10%; Voltage Rated: 50V; Temperature Coefficient: X7R; Voltage Rating: 50V
J2 = HR911105A_C12074: 连接器类型:RJ45插座;安装方式:弯插;端口数量:1;LED:带LED;屏蔽:有屏蔽;等级:-;触头材质:磷青铜;触头镀层:金;工作温度:0℃~+70℃;; LCSC Part Name: 弯插 带LED; Supplier Part: C12074; Manufacturer: HANRUN(汉仁); Supplier Footprint: 插件; JLCPCB Part Class: Extended Part; Datasheet: https://item.szlcsc.com/datasheet/HR911105A/12651.html; Supplier: LCSC; Connector Type: RJ45插座; Mounting Type: 弯插; Number of Ports: 1; LED: 带LED; Shielding: 有屏蔽; PoE: 不带PoE; Supplementary Features: 带滤波; Contact Material: 磷青铜; Contact Plating: 金; Operating Temperature: 0℃~+70℃
R8 R9 = FRC0402F5100TS: 电阻类型:厚膜电阻;阻值:510Ω;精度:±1%;功率:62.5mW;工作电压:50V;温度系数:±100ppm/℃;; LCSC Part Name: 510Ω ±1% 62.5mW 厚膜电阻; Supplier Part: C2909366; Manufacturer: FOJAN(富捷); Supplier Footprint: 0402; JLCPCB Part Class: Extended Part; Datasheet: https://item.szlcsc.com/datasheet/FRC0402F5100TS/3186301.html; Supplier: LCSC; Type: 厚膜电阻; Tolerance: ±1%; Power(Watts): 62.5mW; Voltage-Supply(Max): 50V; Temperature Coefficient: ±100ppm/℃; Operating Temperature: -55℃~+155℃
R10 R43 R59 R60 R62 R63 = RT0603BRE072K49L: 电阻类型:薄膜电阻;阻值:2.49kΩ;精度:±0.1%;功率:100mW;工作电压:75V;温度系数:±50ppm/℃;; LCSC Part Name: 薄膜电阻 2.49kΩ ±0.1% 100mW; Supplier Part: C705842; Manufacturer: YAGEO(国巨); Supplier Footprint: 0603; JLCPCB Part Class: Extended Part; Datasheet: https://item.szlcsc.com/datasheet/RT0603BRE072K49L/742362.html; Supplier: LCSC; Type: 薄膜电阻; Tolerance: ±0.1%; Power(Watts): 100mW; Voltage-Supply(Max): 75V; Temperature Coefficient: ±50ppm/℃; Operating Temperature: -55℃~+155℃
R11 = 0603WAF2201T5E: 电阻类型:厚膜电阻;阻值:2.2kΩ;精度:±1%;功率:100mW;最大工作电压:75V;温度系数:±100ppm/℃;; LCSC Part Name: 2.2kΩ ±1% 100mW 厚膜电阻; Supplier Part: C4190; Manufacturer: UNI-ROYAL(厚声); Supplier Footprint: 0603; JLCPCB Part Class: Basic Part; Datasheet: https://atta.szlcsc.com/upload/public/pdf/source/20200306/C422600_1E6D84923E4A46A82E41ADD87F860B5C.pdf; Supplier: LCSC; Type: 厚膜电阻; Tolerance: ±1%; Power(Watts): 100mW; Overload Voltage (Max): 75V; Temperature Coefficient: ±100ppm/℃; Operating Temperature Range: -55℃~+155℃
R27 = FRC0603F6491TS: 电阻类型:厚膜电阻;阻值:6.49kΩ;精度:±1%;功率:100mW;工作电压:75V;温度系数:±100ppm/℃;; LCSC Part Name: 6.49kΩ ±1% 100mW 厚膜电阻; Supplier Part: C2933249; Manufacturer: FOJAN(富捷); Supplier Footprint: 0603; JLCPCB Part Class: Extended Part; Supplier: LCSC; Type: 厚膜电阻; Tolerance: ±1%; Power(Watts): 100mW; Voltage-Supply(Max): 75V; Temperature Coefficient: ±100ppm/℃; Operating Temperature: -55℃~+155℃
R26 R41 R42 = 0603WAF1002T5E: 电阻类型:厚膜电阻;阻值:10kΩ;精度:±1%;功率:100mW;工作电压:75V;温度系数:±100ppm/℃;; LCSC Part Name: 厚膜电阻 10kΩ ±1% 100mW; Supplier Part: C25804; Manufacturer: UNI-ROYAL(厚声); Supplier Footprint: 0603; JLCPCB Part Class: Basic Part; Datasheet: https://item.szlcsc.com/datasheet/0603WAF1002T5E/26547.html; Supplier: LCSC; Type: 厚膜电阻; Tolerance: ±1%; Power(Watts): 100mW; Voltage-Supply(Max): 75V; Temperature Coefficient: ±100ppm/℃; Operating Temperature: -55℃~+155℃
U3 U8 U14-U16 U20 U21 = BLM18PG121SN1D: 标称阻抗@测试频率:120Ω@100MHz;误差:±25%;直流电阻(RDC):50mΩ;; LCSC Part Name: 0603磁珠 120Ω@100MHz; Supplier Part: C14709; Manufacturer: muRata(村田); Supplier Footprint: 0603; JLCPCB Part Class: Extended Part; Datasheet: https://atta.szlcsc.com/upload/public/pdf/source/20130704/1457706621422.pdf; Supplier: LCSC; Impedance @ Frequency: 120Ω@100MHz; Tolerance: ±25%; DC Resistance: 50mΩ; Current Rating: 2A; Circuits: 1
U19 = DP83825IRMQR: 应用功能:-;通道数:-;MAC接口:RMII;; LCSC Part Name: DP83825I低功耗10/100Mbps以太网物理层收发器; Supplier Part: C783599; Manufacturer: TI(德州仪器); Supplier Footprint: HVQFN-24-EP(3x3); JLCPCB Part Class: Extended Part; Datasheet: https://www.ti.com/cn/lit/gpn/dp83825i; Supplier: LCSC; MAC Interface: RMII; Voltage - Supply: 1.8V；3.3V; Operating Temperature: -40℃~+85℃
X4 = X322525MOB4SI: 晶振类型:贴片晶振;频率:25MHz;常温频差:±10ppm;负载电容:12pF;频率稳定度:±20ppm;; LCSC Part Name: YSX321SL 25MHZ 4P 3225 12PF ±10PPM -40~85℃ (±20PPM); Supplier Part: C9006; Manufacturer: YXC(扬兴晶振); Supplier Footprint: SMD3225-4P; JLCPCB Part Class: Basic Part; Datasheet: https://item.szlcsc.com/datasheet/X322525MOB4SI/9526.html; Supplier: LCSC; Type: 贴片晶振; Normal temperature Frequency Tolerance: ±10ppm; Load Capacitance: 12pF; Frequency Stability: ±20ppm; Operating Temperature: -40℃~+85℃
C3 C10-C12 = CL10A105KB8NNNC: 容值:1uF;精度:±10%;额定电压:50V;温度系数:X5R;; LCSC Part Name: 1uF ±10% 50V; Supplier Part: C15849; Manufacturer: SAMSUNG(三星); Supplier Footprint: 0603; JLCPCB Part Class: Basic Part; Datasheet: https://item.szlcsc.com/datasheet/CL10A105KB8NNNC/16531.html; Supplier: LCSC; Tolerance: ±10%; Voltage Rated: 50V; Temperature Coefficient: X5R; Voltage Rating: 50V
C17 C18 = 0402CG120J500NT: 容值:12pF;精度:±5%;额定电压:50V;温度系数:C0G;; LCSC Part Name: 12pF ±5% 50V; Supplier Part: C1547; Manufacturer: FH(风华); Supplier Footprint: 0402; JLCPCB Part Class: Basic Part; Datasheet: https://item.szlcsc.com/datasheet/0402CG120J500NT/1899.html; Supplier: LCSC; Tolerance: ±5%; Voltage Rating: 50V; Temperature Coefficient: C0G
C19 C20 = CC0603KRX7R9BB104: 容值:100nF;精度:±10%;额定电压:50V;温度系数:X7R;; LCSC Part Name: 100nF ±10% 50V; Supplier Part: C14663; Manufacturer: YAGEO(国巨); Supplier Footprint: 0603; JLCPCB Part Class: Basic Part; Datasheet: https://atta.szlcsc.com/upload/public/pdf/source/20250214/096C4C206003071F5D32E5F0D8E7F8DF.pdf; Supplier: LCSC; Tolerance: ±10%; Voltage Rated: 50V; Temperature Coefficient: X7R; Voltage Rating: 50V
C68-C70 = CGA0805X5R226M250MT: 容值:22uF;精度:±20%;额定电压:25V;温度系数:X5R;; LCSC Part Name: 22uF ±20% 25V; Supplier Part: C6119899; Manufacturer: HRE(芯声); Supplier Footprint: 0805; JLCPCB Part Class: Extended Part; Datasheet: https://item.szlcsc.com/datasheet/CGA0805X5R226M250MT/7062605.html; Supplier: LCSC; Tolerance: ±20%; Voltage Rating: 25V; Temperature Coefficient: X5R
C8 C39-C42 C45-C53 C55-C58 C60 C62 C63 C65 C67 C71-C82 C84-C86 = CL05B104KO5NNNC: 容值:100nF;精度:±10%;额定电压:16V;温度系数:X7R;; LCSC Part Name: 100nF ±10% 16V; Supplier Part: C1525; Manufacturer: SAMSUNG(三星); Supplier Footprint: 0402; JLCPCB Part Class: Basic Part; Datasheet: https://item.szlcsc.com/datasheet/CL05B104KO5NNNC/1877.html; Supplier: LCSC; Tolerance: ±10%; Voltage Rating: 16V; Temperature Coefficient: X7R; Check: false
D2 D3 = TPD4E05U06DQAR_C138714: 极性:单向;反向截止电压(Vrwm):5.5V;最大钳位电压:14V;峰值脉冲电流(Ipp)@10/1000us:2.5A;峰值脉冲功率(Ppp)@10/1000us:40W;击穿电压:6V;; LCSC Part Name: 单向ESD; Supplier Part: C138714; Manufacturer: TI(德州仪器); Supplier Footprint: USON-10(1x2.5); JLCPCB Part Class: Extended Part; Datasheet: https://www.ti.com/cn/lit/gpn/tpd4e05u06; Supplier: LCSC; polarity: 单向; Reverse Stand-Off Voltage (Vrwm): 5.5V; Maximum Clamping Voltage: 14V; Peak Pulse Current (Ipp)@10/1000us: 2.5A; Peak Pulse Power Dissipation (Ppp)@10/1000us: 40W; Breakdown Voltage: 6V; Number of Lines: 四路; Operating Temperature: -40℃~+125℃@(Ta); Type: ESD
D4 = EZAEG3A50AV: 高速数据线的ESD保护。低电容1005(0402)尺寸：0.05 pF，1608(0603)尺寸：0.10 pF。具有良好的ESD抑制特性和良好的ESD耐受性。符合RoHS标准。推荐用于智能手机、移动电话、RF模块、NFC、GPS以及高速差分数据线如天线电路、HDMI、SATA、USB和Display Port的ESD抑制。; Supplier Part: C543663; Manufacturer: PANASONIC(松下); Supplier Footprint: 0603; JLCPCB Part Class: 扩展库; Datasheet: https://atta.szlcsc.com/upload/public/pdf/source/20200908/C543663_3F5D1CAB9E1919450788984DA24853A3.pdf; Supplier: LCSC
HDMI1 = HDMI-001S: 19PIN A型前插后贴HDMI插座 铜壳; Supplier Part: C720616; Manufacturer: XUNPU(讯普); Supplier Footprint: SMD; JLCPCB Part Class: 扩展库; Datasheet: https://atta.szlcsc.com/upload/public/pdf/source/20230810/ECFF1CC9EF38DC7E290ED6B9AC4EFC06.pdf; Supplier: LCSC; Connector Type: HDMI-A; Gender: 母; Number of Pins: 19P; Mounting Style: 卧贴
MS_LED1 = NCD0603R1_C84263: 灯头类型:-;发光颜色:红色;正向压降(Vf):1.6V~2.6V;功率:65mW;正向电流:25mA;波长:615nm~630nm;二极管配置:独立二极管;透镜颜色:-;色温:-;发光强度:80mcd~220mcd;发光角度:130°;载带方式:-;工作温度:-30℃~+85℃;; Supplier Part: C84263; Manufacturer: 国星光电; Supplier Footprint: 0603; JLCPCB Part Class: Extended Part; Datasheet: https://atta.szlcsc.com/upload/public/pdf/source/20200820/C84263_DABC6A75E58F576973B407FDBA283D60.pdf; Supplier: LCSC; Illumination Color: 红色; Voltage - Forward(Vf): 1.6V~2.6V; Power(Watts): 65mW; Forward Current: 25mA; Wavelength - Dominant: 615nm~630nm; Diode Configuration: 独立二极管; Luminous Intensity: 80mcd~220mcd; Viewing Angle: 130°; Operating Temperature: -30℃~+85℃
R32 = RC0402FR-074K7L: 电阻类型:厚膜电阻;阻值:4.7kΩ;精度:±1%;功率:62.5mW;工作电压:50V;温度系数:±100ppm/℃;; LCSC Part Name: 厚膜电阻 4.7kΩ ±1% 62.5mW; Supplier Part: C105871; Manufacturer: YAGEO(国巨); Supplier Footprint: 0402; JLCPCB Part Class: Extended Part; Datasheet: https://item.szlcsc.com/datasheet/RC0402FR-074K7L/107086.html; Supplier: LCSC; Type: 厚膜电阻; Tolerance: ±1%; Power(Watts): 62.5mW; Voltage-Supply(Max): 50V; Temperature Coefficient: ±100ppm/℃; Operating Temperature: -55℃~+155℃
R34 R40 = 0603WAF1001T5E: 电阻类型:厚膜电阻;阻值:1kΩ;精度:±1%;功率:100mW;最大工作电压:75V;温度系数:±100ppm/℃;; LCSC Part Name: 1kΩ ±1% 100mW 厚膜电阻; Supplier Part: C21190; Manufacturer: UNI-ROYAL(厚声); Supplier Footprint: 0603; JLCPCB Part Class: Basic Part; Datasheet: https://atta.szlcsc.com/upload/public/pdf/source/20200306/C422600_1E6D84923E4A46A82E41ADD87F860B5C.pdf; Supplier: LCSC; Type: 厚膜电阻; Tolerance: ±1%; Power(Watts): 100mW; Overload Voltage (Max): 75V; Temperature Coefficient: ±100ppm/℃; Operating Temperature Range: -55℃~+155℃
R35-R39 = 0603WAF4701T5E: 电阻类型:厚膜电阻;阻值:4.7kΩ;精度:±1%;功率:100mW;最大工作电压:75V;温度系数:±100ppm/℃;; LCSC Part Name: 4.7kΩ ±1% 100mW 厚膜电阻; Supplier Part: C23162; Manufacturer: UNI-ROYAL(厚声); Supplier Footprint: 0603; JLCPCB Part Class: Basic Part; Datasheet: https://atta.szlcsc.com/upload/public/pdf/source/20200306/C422600_1E6D84923E4A46A82E41ADD87F860B5C.pdf; Supplier: LCSC; Type: 厚膜电阻; Tolerance: ±1%; Power(Watts): 100mW; Overload Voltage (Max): 75V; Temperature Coefficient: ±100ppm/℃; Operating Temperature Range: -55℃~+155℃
U5 = AT24C16C-STUM-T: 接口类型:I2C;存储容量:16Kbit;时钟频率(fc):1MHz;; LCSC Part Name: 兼容I²C（两线制）的16 Kbit串行EEPROM; Supplier Part: C2061175; Manufacturer: MICROCHIP(美国微芯); Supplier Footprint: SOT-23-5; JLCPCB Part Class: Extended Part; Datasheet: https://item.szlcsc.com/datasheet/AT24C16C-STUM-T/2152748.html; Supplier: LCSC; Interface: I2C; Memory Size: 16Kbit; Clock Frequency: 1MHz; Write Cycle Time(Tw): 5ms; Data Retention - TDR (Year): 100年; Write Cycle Endurance: 100万次; Features: 硬件写保护功能；噪声抑制功能；内置上电复位(POR); Voltage - Supply: 1.7V~5.5V; Operating Temperature: -40℃~+85℃
U6 = MS2109: Datasheet: 无; Check: false
X3 = X322524MOB4SI: 晶振类型:贴片晶振;频率:24MHz;常温频差:±10ppm;负载电容:12pF;频率稳定度:±20ppm;; LCSC Part Name: YSX321SL 24MHZ 4P 3225 12PF ±10PPM -40~85℃ (±20PPM); Supplier Part: C70590; Manufacturer: YXC(扬兴晶振); Supplier Footprint: SMD3225-4P; JLCPCB Part Class: Extended Part; Datasheet: https://item.szlcsc.com/datasheet/X322524MOB4SI/71688.html; Supplier: LCSC; Type: 贴片晶振; Normal temperature Frequency Tolerance: ±10ppm; Load Capacitance: 12pF; Frequency Stability: ±20ppm; Operating Temperature: -40℃~+85℃
C2 C14 = CL05B104KO5NNNC: 容值:100nF;精度:±10%;额定电压:16V;温度系数:X7R;; LCSC Part Name: 100nF ±10% 16V; Supplier Part: C1525; Manufacturer: SAMSUNG(三星); Supplier Footprint: 0402; JLCPCB Part Class: Basic Part; Datasheet: https://item.szlcsc.com/datasheet/CL05B104KO5NNNC/1877.html; Supplier: LCSC; Tolerance: ±10%; Voltage Rating: 16V; Temperature Coefficient: X7R
C15 C16 = CL10C200JB8NNNC: 容值:20pF;精度:±5%;额定电压:50V;温度系数:C0G;; LCSC Part Name: 20pF ±5% 50V; Supplier Part: C1648; Manufacturer: SAMSUNG(三星); Supplier Footprint: 0603; JLCPCB Part Class: Basic Part; Datasheet: https://item.szlcsc.com/datasheet/CL10C200JB8NNNC/2000.html; Supplier: LCSC; Tolerance: ±5%; Voltage Rating: 50V; Temperature Coefficient: C0G
C31 C32 C37 C38 C43 C44 C91 C92 C109 = CL21A106KAYNNNE_C15850: 容值:10uF;精度:±10%;额定电压:25V;温度系数:X5R;; LCSC Part Name: 10uF ±10% 25V; Supplier Part: C15850; Manufacturer: SAMSUNG(三星); Manufacturer Part: CL21A106KAYNNNE; Supplier Footprint: 0805; JLCPCB Part Class: Basic Part; Datasheet: https://item.szlcsc.com/datasheet/CL21A106KAYNNNE/16532.html; Supplier: LCSC; Tolerance: ±10%; Voltage Rated: 25V; Temperature Coefficient: X5R; Voltage Rating: 25V
C54 = CL10A106MA8NRNC: 容值:10uF;精度:±20%;额定电压:25V;温度系数:X5R;; LCSC Part Name: 10uF ±20% 25V; Supplier Part: C96446; Manufacturer: SAMSUNG(三星); Supplier Footprint: 0603; JLCPCB Part Class: Basic Part; Datasheet: https://item.szlcsc.com/datasheet/CL10A106MA8NRNC/97651.html; Supplier: LCSC; Tolerance: ±20%; Voltage Rating: 25V; Temperature Coefficient: X5R
C66 = HGC0402R5106M100NTEJ: 容值:10uF;精度:±20%;额定电压:10V;温度系数:X5R;; LCSC Part Name: 10uF ±20% 10V; Supplier Part: C7472949; Manufacturer: Chinocera(华瓷); Supplier Footprint: 0402; JLCPCB Part Class: Extended Part; Datasheet: https://item.szlcsc.com/datasheet/HGC0402R5106M100NTEJ/8532796.html; Supplier: LCSC; Tolerance: ±20%; Voltage Rating: 10V; Temperature Coefficient: X5R
LED1 Locate_Led1 = GL0603UR01: 灯头类型:-;发光颜色:红色;正向压降(Vf):2.4V;功率:-;正向电流:20mA;波长:620nm~625nm;二极管配置:独立二极管;透镜颜色:无色透明透镜;色温:-;发光强度:120mcd;发光角度:120°;载带方式:正贴;工作温度:-40℃~+85℃;; LCSC Part Name: 0603 红灯 高亮; Supplier Part: C51933292; Manufacturer: Guiguang light(桂光光电); Supplier Footprint: 0603; JLCPCB Part Class: Extended Part; Datasheet: https://item.szlcsc.com/datasheet/GL0603UR01/54645988.html; Supplier: LCSC; Illumination Color: 红色; Voltage - Forward(Vf): 2.4V; Forward Current: 20mA; Wavelength - Dominant: 620nm~625nm; Diode Configuration: 独立二极管; Lens Color: 无色透明透镜; Luminous Intensity: 120mcd; Viewing Angle: 120°; Mounting Style: 正贴; Operating Temperature: -40℃~+85℃
R12-R19 R25 = FRC0402F1002TS: 电阻类型:厚膜电阻;阻值:10kΩ;精度:±1%;功率:62.5mW;工作电压:50V;温度系数:±100ppm/℃;; LCSC Part Name: 10kΩ ±1% 62.5mW 厚膜电阻; Supplier Part: C2906861; Manufacturer: FOJAN(富捷); Supplier Footprint: 0402; JLCPCB Part Class: Extended Part; Datasheet: https://item.szlcsc.com/datasheet/FRC0402F1002TS/3180374.html; Supplier: LCSC; Type: 厚膜电阻; Tolerance: ±1%; Power(Watts): 62.5mW; Voltage-Supply(Max): 50V; Temperature Coefficient: ±100ppm/℃; Operating Temperature: -55℃~+155℃
R28 = 0402WGF220JTCE: 电阻类型:厚膜电阻;阻值:22Ω;精度:±1%;功率:62.5mW;最大工作电压:50V;温度系数:±100ppm/℃;; LCSC Part Name: 22Ω ±1% 62.5mW 厚膜电阻; Supplier Part: C25092; Manufacturer: UNI-ROYAL(厚声); Supplier Footprint: 0402; JLCPCB Part Class: Basic Part; Datasheet: https://atta.szlcsc.com/upload/public/pdf/source/20200306/C422600_1E6D84923E4A46A82E41ADD87F860B5C.pdf; Supplier: LCSC; Type: 厚膜电阻; Tolerance: ±1%; Power(Watts): 62.5mW; Overload Voltage (Max): 50V; Temperature Coefficient: ±100ppm/℃; Operating Temperature Range: -55℃~+155℃
R29 R30 = RMC04024.02K1%N: 电阻类型:厚膜电阻;阻值:4.02kΩ;精度:±1%;功率:62.5mW;工作电压:50V;温度系数:±100ppm/℃;; LCSC Part Name: 4.02kΩ ±1% 62.5mW; Supplier Part: C325528; Manufacturer: Tyohm(幸亚电阻); Supplier Footprint: 0402; JLCPCB Part Class: Extended Part; Datasheet: https://item.szlcsc.com/datasheet/RMC04024.02K1%2525N/305733.html; Supplier: LCSC; Type: 厚膜电阻; Tolerance: ±1%; Power(Watts): 62.5mW; Voltage-Supply(Max): 50V; Temperature Coefficient: ±100ppm/℃; Operating Temperature: -55℃~+155℃
R31 R55 R61 = Res_0603: Supplier Footprint: 0603
R48 = 0603WAF1001T5E: 电阻类型:厚膜电阻;阻值:1kΩ;精度:±1%;功率:100mW;工作电压:75V;温度系数:±100ppm/℃;; LCSC Part Name: 1kΩ ±1% 100mW 厚膜电阻; Supplier Part: C21190; Manufacturer: UNI-ROYAL(厚声); Supplier Footprint: 0603; JLCPCB Part Class: Basic Part; Datasheet: https://item.szlcsc.com/datasheet/0603WAF1001T5E/21904.html; Supplier: LCSC; Type: 厚膜电阻; Tolerance: ±1%; Power(Watts): 100mW; Overload Voltage (Max): 75V; Temperature Coefficient: ±100ppm/℃; Operating Temperature Range: -55℃~+155℃; Voltage-Supply(Max): 75V; Operating Temperature: -55℃~+155℃
U4 = GD5F2GQ5UEYIGR: 存储容量:2Gbit;时钟频率(fc):104MHz;工作电压:2.7V~3.6V;; LCSC Part Name: 2Gbit SPI NAND 3.3V; Supplier Part: C2880463; Manufacturer: GigaDevice(兆易创新); Supplier Footprint: WSON-8-EP(6x8); JLCPCB Part Class: Extended Part; Datasheet: https://item.szlcsc.com/datasheet/GD5F2GQ5UEYIGR/3090913.html; Supplier: LCSC; Memory Size: 2Gbit; Interface: SPI; Clock Frequency: 104MHz; Voltage - Supply: 2.7V~3.6V; Page Program time (TPP): 300us; Block Erase Time(tBE): 3ms; Data Retention - TDR (Year): 10年; Operating Temperature: -40℃~+85℃; Standby Supply Current: 50uA; Program / Erase Cycles: 10万次
U13 = ESP32-P4NRW32_C22387510: 是一款高性能 MCU，支持超大片上内存，具有强大的图像和语音处理能力。该款 MCU 包含一个高性能（HP）系统和一个低功耗（LP）系统。HP 系统由 RISC-V 双核处理器驱动，包含丰富的外设；LP 系统由 RISC-V 单核处理器驱动，其外设针对低功耗应用进行了优化。; LCSC Part Name: 不带固件 搭载RISC-V32位双核与单核处理器的高性能MCU，具备强大图像与语音处理能力，芯片封装内可叠封PSRAM，拥有丰富外设; Supplier Part: C22387510; Manufacturer: ESPRESSIF(乐鑫); Manufacturer Part: ESP32-P4NRW32; Supplier Footprint: QFN-104(10x10); JLCPCB Part Class: Extended Part; Datasheet: https://item.szlcsc.com/datasheet/ESP32-P4NRW32/23950580.html; Supplier: LCSC
U22 = GD25Q128EWIGR: 接口类型:SPI;存储容量:128Mbit;时钟频率(fc):133MHz;; LCSC Part Name: 双路和四路串行闪存; Supplier Part: C2982923; Manufacturer: GigaDevice(兆易创新); Supplier Footprint: WSON-8-EP(5x6); JLCPCB Part Class: Extended Part; Datasheet: https://item.szlcsc.com/datasheet/GD25Q128EWIGR/3415471.html; Supplier: LCSC; Interface: SPI; Memory Size: 128Mbit; Clock Frequency: 133MHz; Voltage - Supply: 2.7V~3.6V; Standby Supply Current: 14uA; Program / Erase Cycles: 100000次; Page Programming Time (Tpp): 500us; Block Erase Time(tBE): 150ms@(32KB)；250ms@(64KB); Data Retention - TDR (Year): 20年; Operating Temperature: -40℃~+85℃
U23 = ZX-SH1.0-3PLT: 插针结构:1x3P;间距:1mm;安装方式:立贴;参考系列:SH;总PIN数:3P;排数:1;每排PIN数:3;行距:-;额定电流:1A;触头材质:黄铜;触头镀层:锡;工作温度:-40℃~+85℃;; LCSC Part Name: 1x3P 间距:1mm 立贴 系列:SH; Supplier Part: C7430452; Manufacturer: Megastar(兆星); Supplier Footprint: SMD,P=1mm; JLCPCB Part Class: Extended Part; Datasheet: https://item.szlcsc.com/datasheet/ZX-SH1.0-3PLT/8430321.html; Supplier: LCSC; Pins Structure: 1x3P; Pitch: 1mm; Mounting Type: 立贴; Reference Series: SH; Number of Pins: 3P; Number of Rows: 1; Number of PINs Per Row: 3; Current Rating: 1A; Contact Material: 黄铜; Contact Plating: 锡; Operating Temperature: -40℃~+85℃; Voltage Rating: 50V; Plastic Material: LCP; Supplementary Features: 辅助焊脚; Color: 米色; Z-Height of the Board: 4.4mm; X-Length of Bottom Edge on Board (Spacing Line): 5.35mm; Y-Width of Bottom Edge on Board: 3.05mm
X2 = X322540MPB4SI: 晶振类型:贴片晶振;频率:40MHz;常温频差:±10ppm;负载电容:15pF;频率稳定度:±20ppm;; LCSC Part Name: YSX321SL 40MHZ 4P 3225 15PF ±10PPM -40~85℃ (±20PPM); Supplier Part: C9010; Manufacturer: YXC(扬兴晶振); Supplier Footprint: SMD3225-4P; JLCPCB Part Class: Extended Part; Datasheet: https://item.szlcsc.com/datasheet/X322540MPB4SI/9530.html; Supplier: LCSC; Type: 贴片晶振; Normal temperature Frequency Tolerance: ±10ppm; Load Capacitance: 15pF; Frequency Stability: ±20ppm; Operating Temperature: -40℃~+85℃
U12 = PCIe*1: Check: false
C4 C27 C28 C33 C34 C87 C88 = CL21A226MAQNNNE: 容值:22uF;精度:±20%;额定电压:25V;温度系数:X5R;; LCSC Part Name: 22uF ±20% 25V; Supplier Part: C45783; Manufacturer: SAMSUNG(三星); Supplier Footprint: 0805; JLCPCB Part Class: Basic Part; Datasheet: https://item.szlcsc.com/datasheet/CL21A226MAQNNNE/46786.html; Supplier: LCSC; Tolerance: ±20%; Voltage Rated: 25V; Temperature Coefficient: X5R; Voltage Rating: 25V
C29 C35 C89 = CL10B104KB8NNNC: 容值:100nF;精度:±10%;额定电压:50V;温度系数:X7R;; LCSC Part Name: 100nF ±10% 50V; Supplier Part: C1591; Manufacturer: SAMSUNG(三星); Supplier Footprint: 0603; JLCPCB Part Class: Extended Part; Datasheet: https://item.szlcsc.com/datasheet/CL10B104KB8NNNC/1943.html; Supplier: LCSC; Tolerance: ±10%; Voltage Rating: 50V; Temperature Coefficient: X7R
C30 C36 = CL10C220JB8NNNC: 容值:22pF;精度:±5%;额定电压:50V;温度系数:C0G;; LCSC Part Name: 22pF ±5% 50V; Supplier Part: C1653; Manufacturer: SAMSUNG(三星); Supplier Footprint: 0603; JLCPCB Part Class: Basic Part; Datasheet: https://item.szlcsc.com/datasheet/CL10C220JB8NNNC/2005.html; Supplier: LCSC; Tolerance: ±5%; Voltage Rated: 50V; Temperature Coefficient: C0G; Voltage Rating: 50V
C90 = CC0603JRNPO9BN121: 容值:120pF;精度:±5%;额定电压:50V;温度系数:NP0;; LCSC Part Name: 120pF ±5% 50V; Supplier Part: C107035; Manufacturer: YAGEO(国巨); Supplier Footprint: 0603; JLCPCB Part Class: Extended Part; Datasheet: https://item.szlcsc.com/datasheet/CC0603JRNPO9BN121/108251.html; Supplier: LCSC; Tolerance: ±5%; Voltage Rating: 50V; Temperature Coefficient: NP0
L2-L4 = FNR3015S2R2MT: 电感值:2.2uH;精度:±20%;额定电流:2A;饱和电流(Isat):2A;类型:磁胶屏蔽电感;; LCSC Part Name: 2.2uH ±20% 2A; Supplier Part: C167747; Manufacturer: cjiang(长江微电); Supplier Footprint: SMD,3x3mm; JLCPCB Part Class: Extended Part; Datasheet: https://item.szlcsc.com/datasheet/FNR3015S2R2MT/179130.html; Supplier: LCSC; Tolerance: ±20%; Current Rating: 2A; Current - Saturation(Isat): 2A; DC Resistance(DCR): 78mΩ; Type: 磁胶屏蔽电感
R6 = FRC0603F4533TS: 电阻类型:厚膜电阻;阻值:453kΩ;精度:±1%;功率:100mW;工作电压:75V;温度系数:±100ppm/℃;; LCSC Part Name: 453kΩ ±1% 100mW 厚膜电阻; Supplier Part: C3013202; Manufacturer: FOJAN(富捷); Supplier Footprint: 0603; JLCPCB Part Class: Extended Part; Supplier: LCSC; Type: 厚膜电阻; Tolerance: ±1%; Power(Watts): 100mW; Voltage-Supply(Max): 75V; Temperature Coefficient: ±100ppm/℃; Operating Temperature: -55℃~+155℃
R7 = 0603WAF1003T5E: 电阻类型:厚膜电阻;阻值:100kΩ;精度:±1%;功率:100mW;工作电压:75V;温度系数:±100ppm/℃;; LCSC Part Name: 100kΩ ±1% 100mW 厚膜电阻; Supplier Part: C25803; Manufacturer: UNI-ROYAL(厚声); Supplier Footprint: 0603; JLCPCB Part Class: Basic Part; Datasheet: https://item.szlcsc.com/datasheet/0603WAF1003T5E/26546.html; Supplier: LCSC; Type: 厚膜电阻; Tolerance: ±1%; Power(Watts): 100mW; Overload Voltage (Max): 75V; Temperature Coefficient: ±100ppm/℃; Operating Temperature Range: -55℃~+155℃; Voltage-Supply(Max): 75V; Operating Temperature: -55℃~+155℃
R44-R47 = FRC0603F4993TS: 电阻类型:厚膜电阻;阻值:499kΩ;精度:±1%;功率:100mW;工作电压:75V;温度系数:±100ppm/℃;; LCSC Part Name: 499kΩ ±1% 100mW 厚膜电阻; Supplier Part: C2933229; Manufacturer: FOJAN(富捷); Supplier Footprint: 0603; JLCPCB Part Class: Extended Part; Supplier: LCSC; Type: 厚膜电阻; Tolerance: ±1%; Power(Watts): 100mW; Voltage-Supply(Max): 75V; Temperature Coefficient: ±100ppm/℃; Operating Temperature: -55℃~+155℃
U9 U10 U18 = TLV62569DBVR: 功能类型:降压型;工作电压:2.5V~5.5V;输出电压:600mV~5.5V;输出电流:2A;输出类型:可调;; LCSC Part Name: 降压型 2A 2.5V~5.5V; Supplier Part: C141836; Manufacturer: TI(德州仪器); Supplier Footprint: SOT-23-5; JLCPCB Part Class: Extended Part; Datasheet: https://www.ti.com/cn/lit/gpn/tlv62569; Supplier: LCSC; Function: 降压型; Voltage - Supply: 2.5V~5.5V; Output Voltage: 600mV~5.5V; Output Current: 2A; Frequency - Switching: 1.5MHz; Operating Temperature: -40℃~+125℃@(TJ); Synchronous Rectifier: 是; Number of Outputs: 1; Topology: 降压式; Quiescent Current: 35uA; Switch tube (built-in/external): 内置; Output Type: 可调; Features: 轻载高效模式；过流保护；工作状态指示
C9 = CGA0603X5R106M160JT: 容值:10uF;精度:±20%;额定电压:16V;温度系数:X5R;; LCSC Part Name: 10uF ±20% 16V; Supplier Part: C6119814; Manufacturer: HRE(芯声); Supplier Footprint: 0603; JLCPCB Part Class: Extended Part; Datasheet: https://item.szlcsc.com/datasheet/CGA0603X5R106M160JT/7062520.html; Supplier: LCSC; Tolerance: ±20%; Voltage Rating: 16V; Temperature Coefficient: X5R
CARD1 = XKTF-1307-18: 卡连接方式:翻盖式;卡类型:MicroSD卡(TF卡);连接器类型:卡座;本体最大高度:1.8mm;工作温度:-25℃~+80℃;; LCSC Part Name: 翻盖式 MicroSD卡(TF卡) 卡座; Supplier Part: C883270; Manufacturer: XKB Connection(中国星坤); Supplier Footprint: SMD; JLCPCB Part Class: Extended Part; Datasheet: https://item.szlcsc.com/datasheet/XKTF-1307-18/947999.html; Supplier: LCSC; Card Connection Mode: 翻盖式; Card Type: MicroSD卡(TF卡); Connector Type: 卡座; Height Above Board: 1.8mm; Operating Temperature: -25℃~+80℃
D1 = SLPESD0603M05: 极性:双向;反向截止电压(Vrwm):5V;钳位电压:40V;; LCSC Part Name: 双向ESD 5V截止; Supplier Part: C2980841; Manufacturer: Slkor(萨科微); Supplier Footprint: 0603; JLCPCB Part Class: Extended Part; Datasheet: https://item.szlcsc.com/datasheet/SLPESD0603M05/3404360.html; Supplier: LCSC; Polarity: 双向; Reverse Stand-Off Voltage (Vrwm): 5V; Clamping Voltage: 40V; Reverse Leakage Current (Ir): 10nA; Number of Channels: 单路; Operating Temperature: -55℃~+125℃; Type: ESD; Junction Capacitance: 0.05pF
H3 = X6521WR-2x11H-C60D30: 插针结构:2x11P;间距:2.54mm;行距:2.54mm;圆针/方针:方针;安装类型:-;排数:双排;总PIN位数:22P;额定电流:3A;额定电压:250V;配合针长度:-;塑高:2.5mm;端接针长度:-;触头材质:黄铜;触头镀层:金;工作温度范围:-40℃~+105℃;焊接温度(最大值):260℃;颜色:黑色;; LCSC Part Name: 2x11P 间距:2.54mm 方针; Supplier Part: C725923; Manufacturer: XKB Connection(中国星坤); Supplier Footprint: 弯插,P=2.54mm; JLCPCB Part Class: Extended Part; Supplier: LCSC; Pin Structure: 2x11P; Pitch: 2.54mm; Row Spacing: 2.54mm; Circluar Pins/Square Pins: 方针; Number of Rows: 双排; Number of Pins: 22P; Current Rating (Max): 3A; Voltage Rating (Max): 250V; Insulation Height: 2.5mm; Contact Material: 黄铜; Contact Plating: 金; Operating Temperature Range: -40℃~+105℃; Soldering Temperature(Max): 260℃; Color: 黑色
R1 R3 = 0402WGF1002TCE: 电阻类型:厚膜电阻;阻值:10kΩ;精度:±1%;功率:62.5mW;工作电压:50V;温度系数:±100ppm/℃;; LCSC Part Name: 10kΩ ±1% 62.5mW 厚膜电阻; Supplier Part: C25744; Manufacturer: UNI-ROYAL(厚声); Supplier Footprint: 0402; JLCPCB Part Class: Basic Part; Datasheet: https://item.szlcsc.com/datasheet/0402WGF1002TCE/26487.html; Supplier: LCSC; Type: 厚膜电阻; Tolerance: ±1%; Power(Watts): 62.5mW; Voltage-Supply(Max): 50V; Temperature Coefficient: ±100ppm/℃; Operating Temperature: -55℃~+155℃
R2 R4 = FRC0402J512 TS: 电阻类型:厚膜电阻;阻值:5.1kΩ;精度:±5%;功率:62.5mW;工作电压:50V;温度系数:±100ppm/℃;; LCSC Part Name: 5.1kΩ ±5% 62.5mW 厚膜电阻; Supplier Part: C2906948; Manufacturer: FOJAN(富捷); Supplier Footprint: 0402; JLCPCB Part Class: Extended Part; Supplier: LCSC; Type: 厚膜电阻; Tolerance: ±5%; Power(Watts): 62.5mW; Voltage-Supply(Max): 50V; Temperature Coefficient: ±100ppm/℃; Operating Temperature: -55℃~+155℃
R5 = 0402WGF2201TCE: 电阻类型:厚膜电阻;阻值:2.2kΩ;精度:±1%;功率:62.5mW;工作电压:50V;温度系数:±100ppm/℃;; LCSC Part Name: 2.2kΩ ±1% 62.5mW 厚膜电阻; Supplier Part: C25879; Manufacturer: UNI-ROYAL(厚声); Supplier Footprint: 0402; JLCPCB Part Class: Basic Part; Datasheet: https://item.szlcsc.com/datasheet/0402WGF2201TCE/26622.html; Supplier: LCSC; Type: 厚膜电阻; Tolerance: ±1%; Power(Watts): 62.5mW; Voltage-Supply(Max): 50V; Temperature Coefficient: ±100ppm/℃; Operating Temperature: -55℃~+155℃
R49-R51 = FRC0603J471 TS: 电阻类型:厚膜电阻;阻值:470Ω;精度:±5%;功率:100mW;工作电压:75V;温度系数:±100ppm/℃;; LCSC Part Name: 470Ω ±5% 100mW 厚膜电阻; Supplier Part: C2907172; Manufacturer: FOJAN(富捷); Supplier Footprint: 0603; JLCPCB Part Class: Extended Part; Supplier: LCSC; Type: 厚膜电阻; Tolerance: ±5%; Power(Watts): 100mW; Voltage-Supply(Max): 75V; Temperature Coefficient: ±100ppm/℃; Operating Temperature: -55℃~+155℃
R52 R54 = 0603WAF1002T5E: 电阻类型:厚膜电阻;阻值:10kΩ;精度:±1%;功率:100mW;工作电压:75V;温度系数:±100ppm/℃;; LCSC Part Name: 厚膜电阻 10kΩ ±1% 100mW; Supplier Part: C25804; Manufacturer: UNI-ROYAL(厚声); Supplier Footprint: 0603; JLCPCB Part Class: Basic Part; Datasheet: https://atta.szlcsc.com/upload/public/pdf/source/20200306/C422600_1E6D84923E4A46A82E41ADD87F860B5C.pdf; Supplier: LCSC; Type: 厚膜电阻; Tolerance: ±1%; Power(Watts): 100mW; Voltage-Supply(Max): 75V; Temperature Coefficient: ±100ppm/℃; Operating Temperature: -55℃~+155℃
R53 = FRC0603F2201TS: 电阻类型:厚膜电阻;阻值:2.2kΩ;精度:±1%;功率:100mW;工作电压:75V;温度系数:±100ppm/℃;; LCSC Part Name: 2.2kΩ ±1% 100mW 厚膜电阻; Supplier Part: C2907005; Manufacturer: FOJAN(富捷); Supplier Footprint: 0603; JLCPCB Part Class: Extended Part; Supplier: LCSC; Type: 厚膜电阻; Tolerance: ±1%; Power(Watts): 100mW; Voltage-Supply(Max): 75V; Temperature Coefficient: ±100ppm/℃; Operating Temperature: -55℃~+155℃
U1 U17 = CH343P: 应用功能:USB转UART;USB协议版本:USB 2.0;通道数:-;数据速率:6Mbps;; Supplier Part: C2846043; Manufacturer: WCH(南京沁恒); Supplier Footprint: TQFN-16-EP(3x3); JLCPCB Part Class: Extended Part; Datasheet: https://item.szlcsc.com/datasheet/CH343P/3039795.html; Supplier: LCSC; Applications Function: USB转UART; USB Protocol: USB 2.0; Voltage - Supply: 3.3V；5V; Data Rate: 6Mbps; Operating Temperature: -40℃~+85℃; Current - Supply: 3mA; Supply Current (Iq): 90uA
U2 = EMH4T2R: 数量:2个NPN-预偏置;集射极击穿电压(Vceo):50V;集电极电流(Ic):100mA;耗散功率(Pd):150mW;直流电流增益(hFE):600;; LCSC Part Name: 通用双数字晶体管; Supplier Part: C3588692; Manufacturer: ROHM(罗姆); Supplier Footprint: EMT-6; JLCPCB Part Class: Extended Part; Datasheet: https://item.szlcsc.com/datasheet/EMH4T2R/4155408.html; Supplier: LCSC; Number: 2个NPN-预偏置; Collector - Emitter Voltage VCEO: 50V; Current - Collector(Ic): 100mA; Pd - Power Dissipation: 150mW; type: NPN; DC Current Gain: 600; Emitter-Base Voltage VEBO: 5V; Input Resistor: 13kΩ; Vce Saturation(VCE(sat)): 300mV; Transition frequency(fT): 250MHz; Current - Collector Cutoff: 500nA
U11 = AQS221R2S: Supplier Part: C719729; Manufacturer: PANASONIC(松下); Supplier Footprint: SOIC-16-175mil; JLCPCB Part Class: Extended Part; Supplier: LCSC
USB2 = HX TYPE-C 16P L8.35: 连接器类型:Type-C;协议标准:USB 3.1;公母:母;安装方式:卧贴;触点数量:16P;端口数量:1;额定电流 - 电源:3A;工作温度:-30℃~+80℃;; LCSC Part Name: Type-C 母 卧贴; Supplier Part: C41427493; Manufacturer: hanxia(韩下); Supplier Footprint: SMD; JLCPCB Part Class: Extended Part; Datasheet: https://item.szlcsc.com/datasheet/HX%2520TYPE-C%252016P%2520L8.35/43275705.html; Supplier: LCSC; Connector Type: Type-C; Protocol Standard: USB 3.1; Gender: 母; Mounting Type: 卧贴; Number of Contacts: 16P; Number of Ports: 1; Current Rating-Power: 3A; Voltage Rating: 20V; Connect-Disconnect Life: 5千次; Center Height: 1.68mm; Length: 8.35mm; Detection color: 黑色; Operating Temperature: -30℃~+80℃

## Nets
1V2_SYS: C36.2 C37.2 C38.2 C75.2 C76.2 L3.2 R46.2 U6.19(DVDD12) U6.41(DVDD12) U16.1
3V3_SYS: C2.1 C8.2 C9.2 C19.2 C27.2 C28.2 C29.2 C33.2 C34.2 C35.2 C39.2 C40.2 C42.2 C43.2 C44.2 C45.2 C46.2 C47.2 C48.2 C49.2 C50.2 C51.2 C52.2 C53.2 C80.2 C81.2 C82.2 C84.2 C85.2 C86.2 C90.2 C91.2 C92.2 C99.2 C101.2 C109.2 CARD1.4(VDD) L4.2 R1.1 R3.1 R6.2 R11.2 R15.1 R18.1 R19.2 R26.2 R34.2 R35.2 R36.2 R37.2 R41.2 R42.2 R43.2 U1.1(VIO) U1.3(VDD5) U1.6(V3) U3.2 U4.8(VCC) U5.4(Vcc) U6.16(DVDD33) U6.23(DVDD33) U6.44(DVDD33) U9.4(VIN) U10.1(EN) U10.4(VIN) U11.10 U11.12 U13.9(VDD_LP) U13.21(VDD_IO_0) U13.51(VDD_USBPHY) U13.62(VDD_IO_4) U13.75(VDD_LDO) U13.77(VDD_DCDCC) U13.96(VDD_IO_6) U13.101(VDD_ANA) U13.102(VDD_BAT) U14.1 U15.1 U17.1(VIO) U17.3(VDD5) U17.6(V3) U19.19(VDDIO)
5V_SYS: C4.1 C41.2 C87.2 C88.2 C89.2 D1.2 R5.1 U1.9(VBUS) U18.1(EN) U18.4(VIN) USB2.A4B9(VBUS) USB2.B4A9(VBUS)
12V_SYS: R53.2 U12.B3(+12V)
A1V2_MS: C3.2 C70.2 C73.2 C74.2 U6.27(AVDD12) U6.33(AVDD12) U16.2
A3V3_DP83825I: C7.2 C100.2 U3.1 U19.6(VDDA3V3)
A3V3_MS: C11.2 C69.2 C77.2 C78.2 C79.2 U6.24(AVDD33) U6.30(AVDD33) U6.47(AVDD33) U15.2
GND: C1.1 C2.2 C3.1 C4.2 C5.1 C6.1 C7.1 C8.1 C9.1 C10.1 C11.1 C12.1 C14.2 C15.2 C16.1 C17.2 C18.2 C19.1 C20.1 C27.1 C28.1 C29.1 C31.1 C32.1 C33.1 C34.1 C35.1 C37.1 C38.1 C39.1 C40.1 C41.1 C42.1 C43.1 C44.1 C45.1 C46.1 C47.1 C48.1 C49.1 C50.1 C51.1 C52.1 C53.1 C54.1 C55.1 C56.1 C57.1 C58.1 C59.1 C60.1 C61.1 C62.1 C63.1 C64.1 C65.1 C66.1 C67.1 C68.1 C69.1 C70.1 C71.1 C72.1 C73.1 C74.1 C75.1 C76.1 C77.1 C78.1 C79.1 C80.1 C81.1 C82.1 C84.1 C85.1 C86.1 C87.1 C88.1 C89.1 C91.1 C92.1 C96.2 C97.1 C98.1 C99.1 C100.1 C101.1 C109.1 CARD1.6(VSS) CARD1.9(GND) CARD1.10(GND) CARD1.11(GND) CARD1.12(GND) D1.1 D2.3(GND) D2.8(GND) D3.3(GND) D3.8(GND) D4.1(K) H3.15 H3.16 HDMI1.2(TMDS Data 2 Shield) HDMI1.5(TMDS Data 1 Shield) HDMI1.8(TMDS Data 0 Shield) HDMI1.11(TMDS Clock Shield) HDMI1.17(DDC/CEC Ground) J2.8(CHS GND) J2.10 J2.11 LED1.2(C) Locate_Led1.2(C) R2.1 R4.1 R7.1 R10.2 R27.2 R29.1 R30.1 R32.1 R45.1 R47.1 R49.1 R50.1 R51.2 R52.1 R54.1 R59.2 R60.2 R62.2 R63.2 U1.2(GND) U1.17(EP) U4.4(VSS) U4.9(EP) U5.2(GND) U6.15(VSS) U6.20(VSS) U6.36(VSS) U6.42(VSS) U6.43(VSS) U6.46(VSS) U6.48(VSS) U6.49(EP) U8.1 U9.2(GND) U10.2(GND) U11.6 U11.8 U12.A4(GND) U12.A12(GND) U12.A15(GND) U12.A18(GND) U12.B4(GND) U12.B7(GND) U12.B13(GND) U12.B16(GND) U12.B18(GND) U13.105(GND) U17.2(GND) U17.17(EP) U18.2(GND) U19.9(GND) U19.21(GND) U19.25(EP) U20.1 U21.1 U22.4(VSS) U22.9(EP) U23.3 U23.4 U23.5 USB2.A1B12(GND) USB2.B1A12(GND) X2.2(GND) X2.4(GND) X3.2(GND) X3.4(GND) X4.2(GND) X4.4(GND)
VCC_HP: C30.2 C31.2 C32.2 C54.2 C55.2 C56.2 C57.2 C58.2 L2.2 R44.2 U13.26(VDD_HP_0) U13.54(VDD_HP_1) U13.76(VDD_HP_2) U13.91(VDD_HP_3)
CH343P0_USB_D+: U1.7(UD+) USB2.A6(DP1) USB2.B6(DP2)
CH343P0_USB_D-: U1.8(UD-) USB2.A7(DN1) USB2.B7(DN2)
CH343P0_USB_DTR: U1.12(DTRTNOW) U2.1(E) U2.5(B)
CH343P0_USB_RTS: U1.13(RTS) U2.2(B) U2.4(E)
CH343P0_USB_RXD: U1.5(RXD) U13.69(GPIO37)
CH343P0_USB_TXD: U1.4(TXD) U13.70(GPIO38)
CHIP_PU: C1.2 R1.2 U2.3(C) U13.103(CHIP_PU)
CSI_REXT: R30.2 U13.48(CSI_REXT)
DM_HID: H3.20 U13.55(GPIO26)
DM_MS: U6.5(USBDM) U13.49(DM)
DP_HID: H3.18 U13.56(GPIO27)
DP_MS: U6.4(USBDP) U13.50(DP)
DSI_REXT: R29.2 U13.34(DSI_REXT)
EMMC_CLK: CARD1.5(CLK) U13.84(GPIO43)
EMMC_CMD: CARD1.3(CMD) R14.2 U13.86(GPIO44)
EMMC_D0: CARD1.7(D0) R16.2 U13.80(GPIO39)
EMMC_D1: CARD1.8(D1) R17.2 U13.81(GPIO40)
EMMC_D2: CARD1.1(D2) R12.2 U13.82(GPIO41)
EMMC_D3: CARD1.2(D3) R13.2 U13.83(GPIO42)
EMMC_D4: U13.87(GPIO45)
EMMC_D5: U13.88(GPIO46)
ESP32P4_EN_DCDC: U9.1(EN) U13.79(EN_DCDC)
ESP32P4_FB_DCDC: C30.1 R44.1 R45.2 U9.5(FB) U13.78(FB_DCDC)
ETH_INT_PWDN: R42.1 U13.25(GPIO23) U19.3(INTR/PWRDN)
ETH_LED_GPIO15: R9.1 U13.16(GPIO15)
ETH_RST_N: C98.2 R41.1 U13.24(GPIO22) U19.5(RST_N)
GPIO0: R54.2 U11.9 U13.104(GPIO0)
GPIO1: R52.2 U11.11 U13.1(GPIO1)
GPIO1_MS: U6.40(GPIO1)
GPIO2: H3.4 U13.2(GPIO2)
GPIO3: H3.2 U13.3(GPIO3)
GPIO4: U11.1 U13.4(GPIO4)
GPIO5: U11.3 U13.5(GPIO5)
GPIO16: R35.1 U5.5(WP) U13.17(GPIO16)
GPIO17: R48.1 U13.18(GPIO17)
GPIO18: U13.19(GPIO18)
GPIO36: R26.1 U13.68(GPIO36)
GPIO49: U13.92(GPIO49)
GPIO50: U13.93(GPIO50) U17.4(TXD)
GPIO51: U13.94(GPIO51) U17.5(RXD)
HDMI_0N-: D3.2(IN2) D3.9(NC) HDMI1.9(TMDS Data 0-) U6.28(HDMIRX0N)
HDMI_0P+: D3.1(IN1) D3.10(NC) HDMI1.7(TMDS Data 0+) U6.29(HDMIRX0P)
HDMI_1N-: D2.5(IN4) D2.6(NC) HDMI1.6(TMDS Data 1-) U6.31(HDMIRX1N)
HDMI_1P+: D2.4(IN3) D2.7(NC) HDMI1.4(TMDS Data 1+) U6.32(HDMIRX1P)
HDMI_2N-: D2.2(IN2) D2.9(NC) HDMI1.3(TMDS Data 2-) U6.34(HDMIRX2N)
HDMI_2P+: D2.1(IN1) D2.10(NC) HDMI1.1(TMDS Data 2+) U6.35(HDMIRX2P)
HDMI_5V: C20.2 D4.2(A) HDMI1.18(+5V Power) R38.1 R39.1 R40.1
HDMI_CN-: D3.5(IN4) D3.6(NC) HDMI1.12(TMDS Clock-) U6.25(HDMIRXCN)
HDMI_CP+: D3.4(IN3) D3.7(NC) HDMI1.10(TMDS Clock+) U6.26(HDMIRXCP)
HDMIDET: R40.2 U6.18(HDMIRXDET)
HDMIHPD: HDMI1.19(Hot Plug Detect) U6.17(HDMIRXHPD)
HDMISCL: HDMI1.15(SCL) R38.2 U6.22(RXDDCSCL)
HDMISDA: HDMI1.16(SDA) R39.2 U6.21(RXDDCSDA)
HXIN: C17.1 U6.1(XTIN) X3.1(OSC1)
HXOUT: C18.1 U6.2(XTOUT) X3.3(OSC2)
LED_MS: MS_LED1.1(K) U6.39(GPIO0)
MDC: U13.22(GPIO20) U19.16(MDC)
MDIO: R11.1 U13.23(GPIO21) U19.15(MDIO)
MS_SCL: H3.1 R31.1 R36.1 U5.1(SCL) U6.13(GPIO2(SCL))
MS_SDA: H3.3 R37.1 R61.1 U5.3(SDA) U6.14(GPIO3(SDA))
P4_FLASH_CK: R28.1 U22.6(SCLK)
P4_FLASH_CS: R25.2 U13.27(FLASH_CS) U22.1(CS#)
P4_FLASH_D: U13.33(FLASH_D) U22.5(SI(IO0))
P4_FLASH_HOLD: U13.31(FLASH_HOLD) U22.7(HOLD#/RESET#(IO3))
P4_FLASH_Q: U13.28(FLASH_Q) U22.2(SO(IO1))
P4_FLASH_WP: U13.29(FLASH_WP) U22.3(WP#(IO2))
P4_VDDO1_FLASH: C14.1 C59.2 C60.2 R25.1 U13.30(VDD_FLASHIO) U13.71(VDDO_FLASH) U22.8(VCC)
P4_VDDO2_PSRAM: C61.2 C62.2 C63.2 U13.59(VDD_PSRAM_0) U13.67(VDD_PSRAM_1) U13.72(VDDO_PSRAM)
P4_VDDO3_MIPI: C64.2 C65.2 U13.41(VDD_MIPI_DPHY) U13.73(VDDO_3)
P4_VDDO4_SDIO: C66.2 C67.2 R12.1 R13.1 R14.1 R16.1 R17.1 U13.74(VDDO_4) U13.85(VDD_IO_5)
P4_XTAL_N: C15.1 U13.99(XTAL_N) X2.3(OSC2)
P4_XTAL_P: C16.2 U13.100(XTAL_P) X2.1(OSC1)
PERn0: U12.A17(PERn0)
PERp0: U12.A16(PERp0)
PERST#: U12.A11(PERST#)
PETn0: U12.B15(PETn0)
PETp0: U12.B14(PETp0)
PHY_LED0: R8.1 R62.1 U19.4(LED0)
PRSNT1#: R55.1 U12.A1(PRSNT1#)
PRSNT2#: R55.2 U12.B17(PRSNT2#)
PWR_SW1: H3.5 H3.6 U11.13
PWR_SW2: H3.7 H3.8 U11.14
RD+: J2.3(RD+) U19.8(RD_P)
RD-: J2.6(RD-) U19.7(RD_M)
REFCLK+: U12.A13(REFCLK+)
REFCLK-: U12.A14(REFCLK-)
REXT_MS: R32.2 U6.3(REXT)
RMII_CLK: R10.1 U13.63(GPIO32) U19.2(50MHzOut/LED2)
RMII_CRS_DV: R63.1 U13.57(GPIO28) U19.20(CRS_DV)
RMII_RX_ER_GPIO31: R60.1 U13.61(GPIO31) U19.22(RX_ER)
RMII_RXD0: R43.1 U13.58(GPIO29) U19.18(RX_D0)
RMII_RXD1: R59.1 U13.60(GPIO30) U19.17(RX_D1)
RMII_TX_EN: U13.64(GPIO33) U19.1(TX_EN)
RMII_TXD0: U13.65(GPIO34) U19.23(TX_D0)
RMII_TXD1_GPIO35: R3.2 U2.6(C) U13.66(GPIO35) U19.24(TX_D1)
RST_SW1: H3.9 H3.10 U11.15
RST_SW2: H3.11 H3.12 U11.16
SCL: R31.2 U13.89(GPIO47)
SDA: R61.2 U13.90(GPIO48)
SPI1_CLK_GPIO9: U4.6(SCLK) U13.10(GPIO9)
SPI1_CS_GPIO7: R15.2 U4.1(CS#) U13.7(GPIO7)
SPI1_IO0_GPIO8: U4.5(SI/SIO0) U13.8(GPIO8)
SPI1_IO1_GPIO10: U4.2(SO/SIO1) U13.11(GPIO10)
SPI1_IO2_GPIO11: R18.2 U4.3(WP#/SIO2) U13.12(GPIO11)
SPI1_IO3_GPIO6: R19.1 U4.7(HOLD#/SIO3) U13.6(GPIO6)
TD+: J2.1(TD+) U19.11(TD_P)
TD-: J2.2(TD-) U19.10(TD_M)
USB1P1_N0: U13.52(GPIO24) U23.1
USB1P1_P0: U13.53(GPIO25) U23.2
USB2_D+: H3.17 U17.7(UD+)
USB2_D-: H3.19 U17.8(UD-)
USB3V3_MS: C10.2 C12.2 C68.2 C71.2 C72.2 U6.6(V33USB) U6.7(V33USB) U6.8(V33USB) U14.2
USB_VBUS: H3.21 H3.22 U17.9(VBUS)
WAKE#: U12.B11(WAKE#)
XI: C96.1 U19.13(XI/50MHzin) X4.3(OSC2)
XO: C97.2 U19.12(XO) X4.1(OSC1)
$1N39290: LED1.1(A) R5.2
$1N39352: R4.2 USB2.B5(CC2)
$1N39354: R2.2 USB2.A5(CC1)
$1N39473: U20.2 USB2.1 USB2.2 USB2.3 USB2.4
$1N39591: R51.1 U11.5
$1N39592: R53.1 U11.7
$1N39604: R50.2 U11.4
$1N39607: R49.2 U11.2
$4N12777: R27.1 U19.14(RBIAS)
$4N12791: J2.SH1 J2.SH2 U8.2
$4N12794: J2.12 R9.2
$4N12797: J2.9 R8.2
$4N12802: C6.2 J2.4
$4N12803: C5.2 J2.5
$5N3531: MS_LED1.2(A) R34.1
$5N70958: HDMI1.20(GND) HDMI1.21(GND) HDMI1.22(GND) HDMI1.23(GND) U21.2
$6N47: L2.1 U9.3(SW)
$6N67: L3.1 U10.3(SW)
$6N72: C36.1 R46.1 R47.2 U10.5(FB)
$6N85: L4.1 U18.3(SW)
$6N90: C90.1 R6.1 R7.2 U18.5(FB)
$10N53: R28.2 U13.32(FLASH_CK)
$10N190: Locate_Led1.1(A) R48.2

Not connected (* = marked no-connect by the designer): H3 13* 14*; HDMI1 13(CEC)* 14(Reserved (N.C.))*; J2 7(NC)*; U1 10(ACT#)* 11(DCD)* 14(DSR)* 15(CTS)* 16(RI)*; U6 9(I2SIN_SCLK)* 10(I2SIN_WS)* 11(I2SIN_SD0)* 12(I2S_MCLKOUT)* 37(GPIO5) 38(SPDIFOUT)* 45(MCU_SEL)*; U12 A2(+12V) A3(+12V) A5(TCK)* A6(TDI)* A7(TDO)* A8(TMS)* A9(+3.3V) A10(+3.3V) B1(+12V) B2(+12V) B5(SMCLK)* B6(SMDAT)* B8(+3.3V) B9(TRST#)* B10(+3.3Vaux) B12(RSVD)*; U13 13(GPIO12) 14(GPIO13) 15(GPIO14) 20(GPIO19) 35(DSI_DATAP1)* 36(DSI_DATAN1)* 37(DSI_CLKN)* 38(DSI_CLKP)* 39(DSI_DATAP0)* 40(DSI_DATAN0)* 42(CSI_DATAN0)* 43(CSI_DATAP0)* 44(CSI_CLKP)* 45(CSI_CLKN)* 46(CSI_DATAN1)* 47(CSI_DATAP1)* 95(GPIO52) 97(GPIO53) 98(GPIO54); U17 10(ACT#)* 11(DCD)* 12(DTRTNOW)* 13(RTS)* 14(DSR)* 15(CTS)* 16(RI)*; USB2 A8(SBU1) B8(SBU2)

## Notes on the sheets
sheet 1
- CUT THIS PIN
sheet 4
- 3V3
  1V2
  VCCHP
sheet 5
- HDMI
- MS2109
  HDMI captrue
  USB
- ESP32-P4NRW32X
  128Mbit SPI Flash
- OC PWRcontrol
  AQS221R2S
  4_Channel GPIO
- 8PIN
  Power Control
- P4-core
- RJ45
- DP83825IRMQR
  100M ETH PHY
  RMII
- 3V3
  TLV62569DBVR
  1V2
  TLV62569DBVR
  VCCHP(1V2)
  TLV62569DBVR
  Use MCU FB/EN
- PowerTree
- USB-C
  (Debug)
- CH343p_0
  external USB to UART
  UART0, CHIP_PU, GPIO35
  Debug
- TF card
  Storage
  SDIO
- CH343p_1
  external USB to UART
  UART1
- 9PIN USB
- 2*Reserved GPIO
  1*I2C, shared with MCU and MS2109
- USB_HID
  GPIO23, 22
sheet 6
- VDD_HP_0/1/2/3: 每脚 100nF，附近再放 10uF
  VDD_DCDCC:      10uF + 100nF
  VDD_LDO:        10uF + 100nF
  VDD_ANA:        1uF + 100nF
  VDD_BAT:        1uF
  VDD_USBPHY:     1uF + 100nF
  VDDO_FLASH:     1uF + 100nF
  VDDO_PSRAM:     1uF + 100nF
  VDDO_3:         1uF
  VDDO_4:         1uF，VDD_IO_5 旁边再放 10uF
